# Altium project measure_dev.PrjPcb
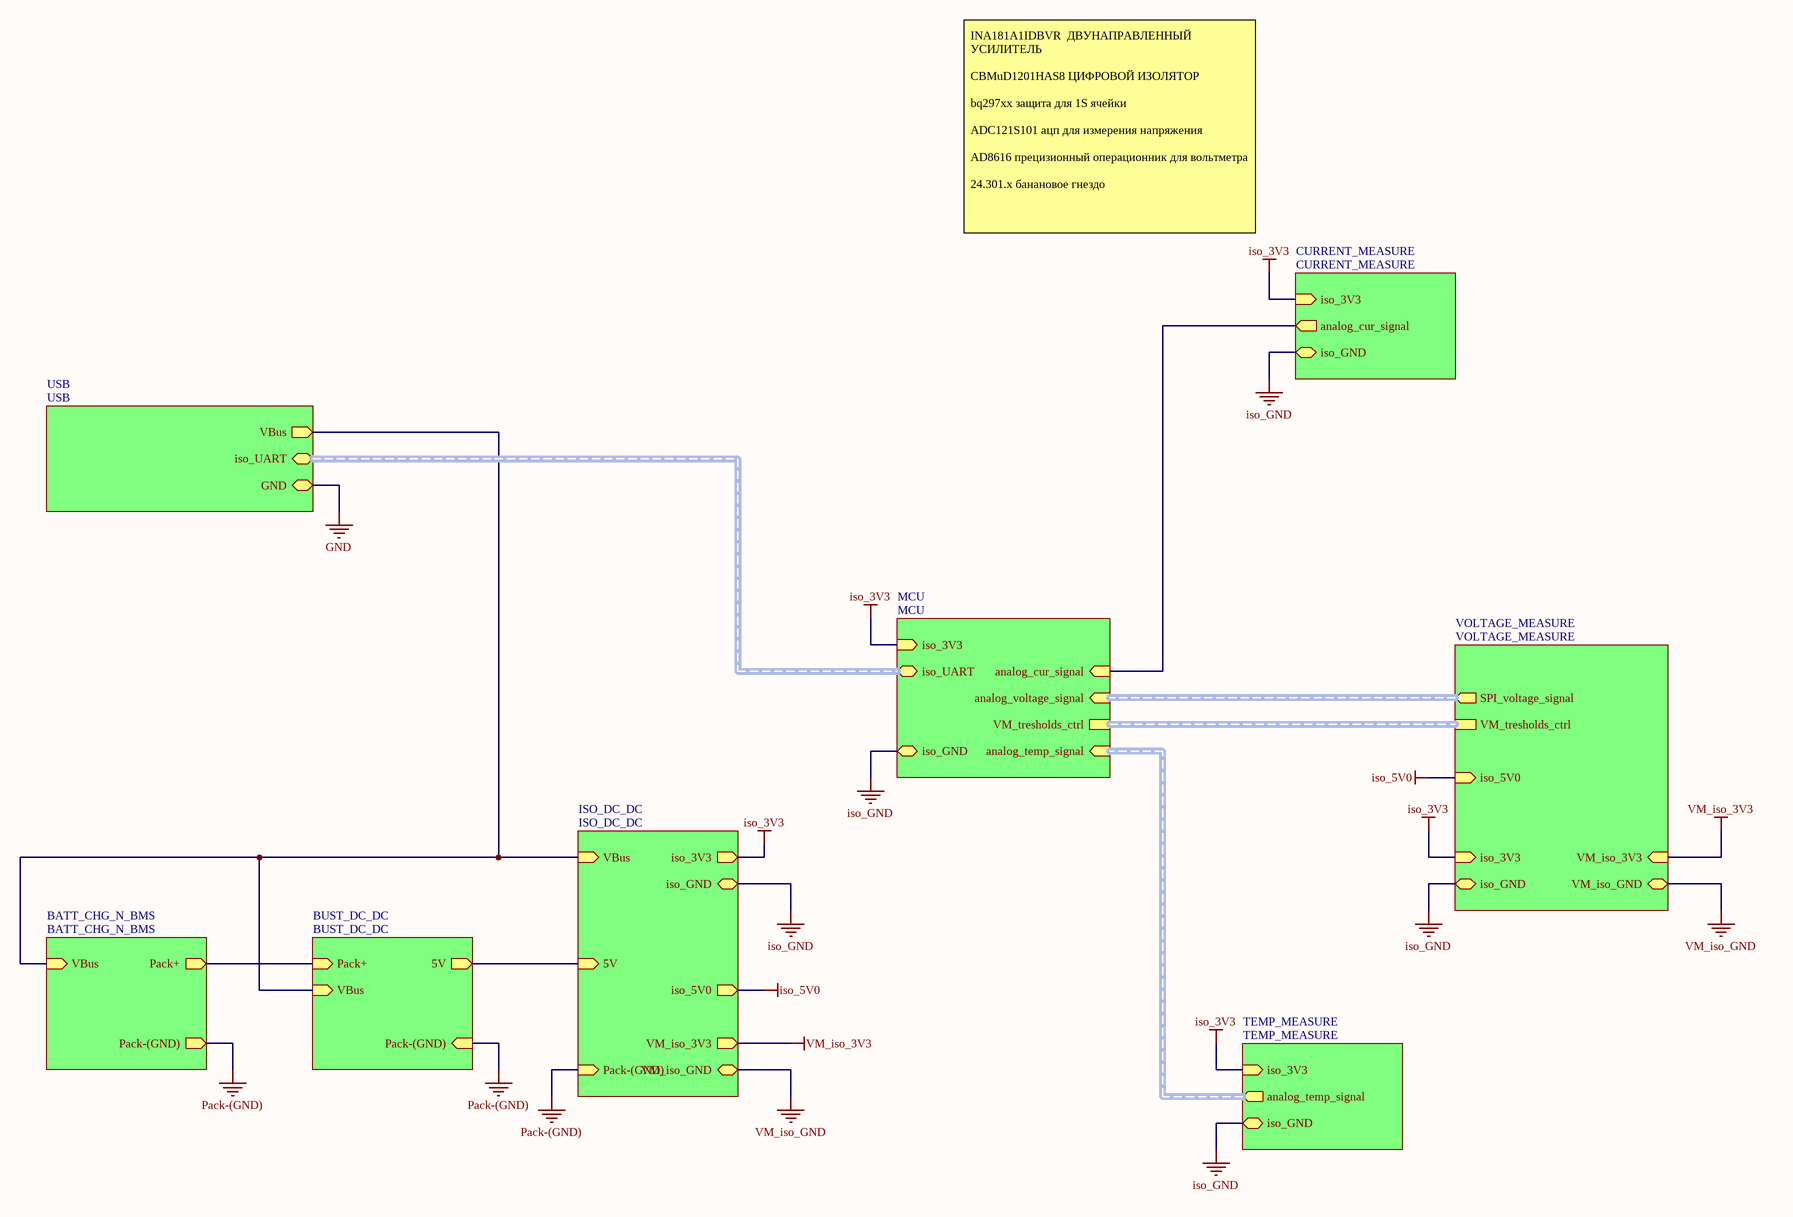
[diagram p0: measure_dev.SchDoc]
9 sheets, 153 parts. Net scope: hierarchical (ports join the sheet entries above them; power ports are global).
Sheets:
  measure_dev.SchDoc
    CURRENT_MEASURE = CURRENT_MEASURE.SchDoc
    MCU = MCU.SchDoc
    USB = USB.SchDoc
    ISO_DC_DC = ISO_DC_DC.SchDoc
    BATT_CHG_N_BMS = BATT_CHG_N_BMS.SchDoc
    BUST_DC_DC = BUST_DC_DC.SchDoc
    VOLTAGE_MEASURE = VOLTAGE_MEASURE.SchDoc
    TEMP_MEASURE = TEMP_MEASURE.SchDoc

## Sheet measure_dev.SchDoc
size A2; SheetNumber: 1; SheetTotal: 9

### Sub-sheets
BATT_CHG_N_BMS = BATT_CHG_N_BMS: VBus (in), Pack+ (out), Pack-(GND) (out)
BUST_DC_DC = BUST_DC_DC: Pack+ (in), 5V (out), Pack-(GND) (in), VBus (in)
CURRENT_MEASURE = CURRENT_MEASURE: iso_3V3 (in), iso_GND (bidir), analog_cur_signal (out)
ISO_DC_DC = ISO_DC_DC: VBus (in), 5V (in), iso_3V3 (out), iso_GND (bidir), VM_iso_3V3 (out), VM_iso_GND (bidir), Pack-(GND) (in), iso_5V0 (out)
MCU = MCU: iso_3V3 (in), iso_GND (bidir), analog_cur_signal (in), iso_UART (bidir), analog_voltage_signal (in), analog_temp_signal (in), VM_tresholds_ctrl
TEMP_MEASURE = TEMP_MEASURE: analog_temp_signal (out), iso_GND (bidir), iso_3V3 (in)
USB = USB: VBus (out), iso_UART (bidir), GND (bidir)
VOLTAGE_MEASURE = VOLTAGE_MEASURE: SPI_voltage_signal (out), iso_GND (bidir), iso_3V3 (in), VM_iso_3V3 (in), VM_iso_GND (bidir), VM_tresholds_ctrl, iso_5V0 (in)

### Nets
5V: sheet ISO_DC_DC/5V, sheet BUST_DC_DC/5V
iso_3V3: sheet CURRENT_MEASURE/iso_3V3, sheet MCU/iso_3V3, sheet ISO_DC_DC/iso_3V3, sheet VOLTAGE_MEASURE/iso_3V3, sheet TEMP_MEASURE/iso_3V3
iso_5V0: sheet ISO_DC_DC/iso_5V0, sheet VOLTAGE_MEASURE/iso_5V0
iso_GND: sheet CURRENT_MEASURE/iso_GND, sheet MCU/iso_GND, sheet ISO_DC_DC/iso_GND, sheet VOLTAGE_MEASURE/iso_GND, sheet TEMP_MEASURE/iso_GND
Pack+: sheet BATT_CHG_N_BMS/Pack+, sheet BUST_DC_DC/Pack+
Pack-(GND): sheet ISO_DC_DC/Pack-(GND), sheet BATT_CHG_N_BMS/Pack-(GND), sheet BUST_DC_DC/Pack-(GND)
VBus: sheet USB/VBus, sheet ISO_DC_DC/VBus, sheet BATT_CHG_N_BMS/VBus, sheet BUST_DC_DC/VBus
VM_iso_3V3: sheet ISO_DC_DC/VM_iso_3V3, sheet VOLTAGE_MEASURE/VM_iso_3V3
VM_iso_GND: sheet ISO_DC_DC/VM_iso_GND, sheet VOLTAGE_MEASURE/VM_iso_GND
NetDD?#1_1: sheet CURRENT_MEASURE/analog_cur_signal, sheet MCU/analog_cur_signal

### Buses and harness runs
harness sheet MCU/analog_temp_signal = sheet TEMP_MEASURE/analog_temp_signal
harness sheet MCU/analog_voltage_signal = sheet VOLTAGE_MEASURE/SPI_voltage_signal
harness sheet MCU/iso_UART = sheet USB/iso_UART
harness sheet MCU/VM_tresholds_ctrl = sheet VOLTAGE_MEASURE/VM_tresholds_ctrl

### Notes on the sheet
- INA181A1IDBVR  ДВУНАПРАВЛЕННЫЙ УСИЛИТЕЛЬ
  CBMuD1201HAS8 ЦИФРОВОЙ ИЗОЛЯТОР
  bq297xx защита для 1S ячейки
  ADC121S101 ацп для измерения напряжения
  AD8616 прецизионный операционник для вольтметра
  24.301.x банановое гнездо

## Sheet CURRENT_MEASURE.SchDoc
size A4; SheetNumber: 4; SheetTotal: 9
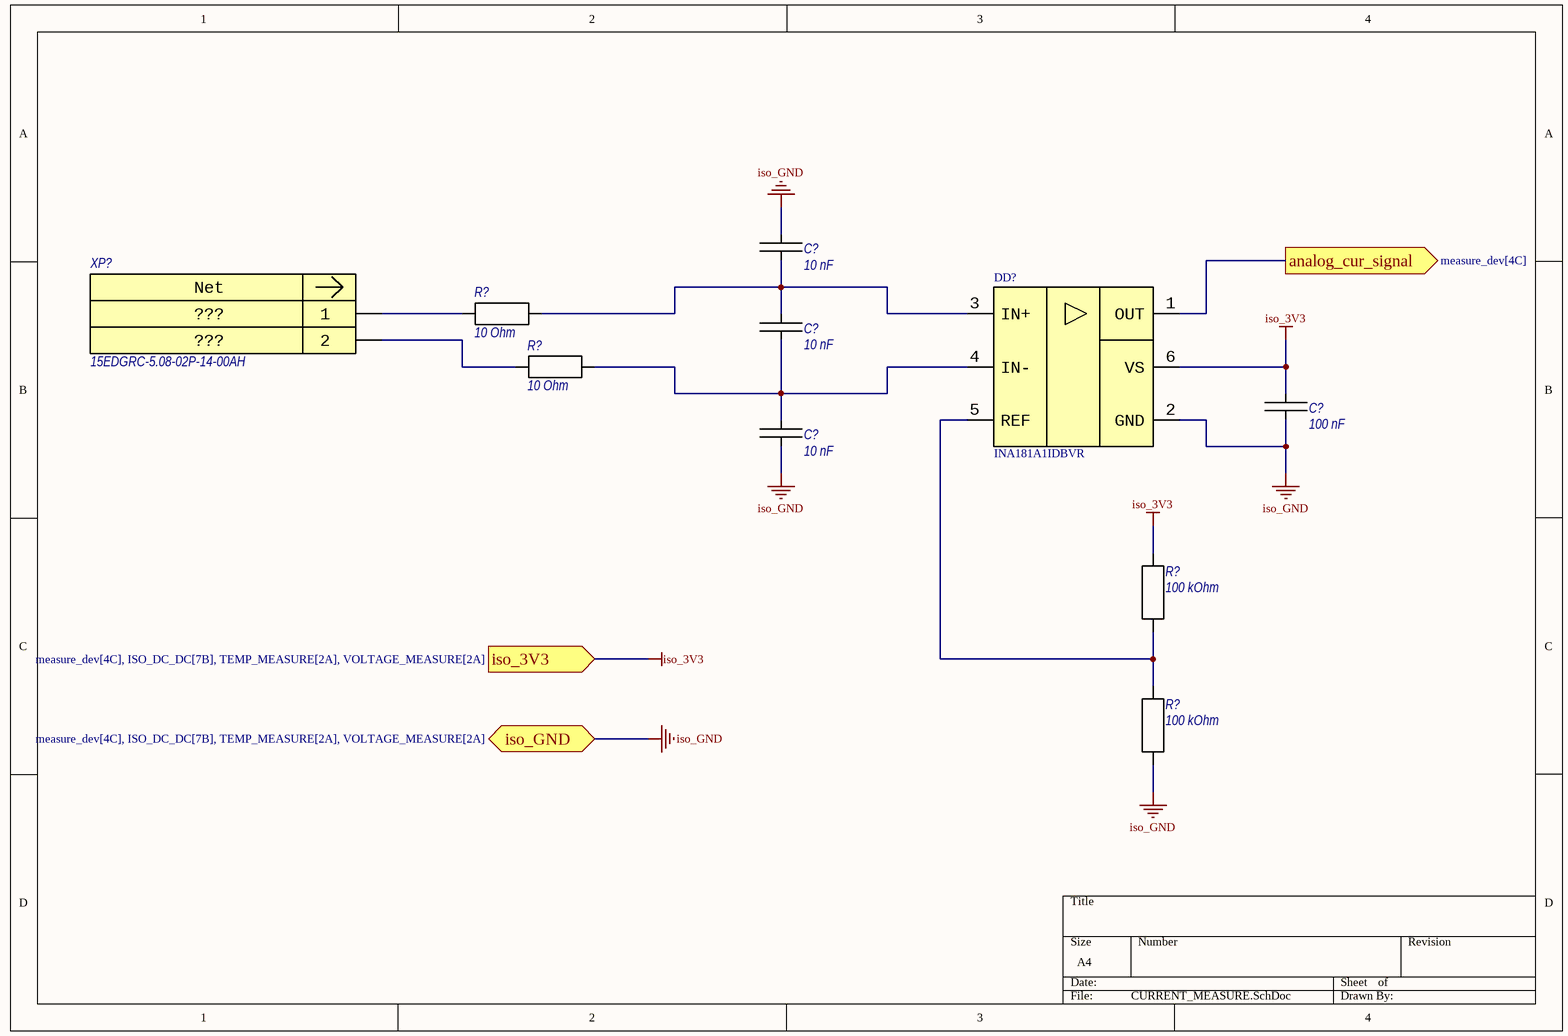
[diagram p1: CURRENT_MEASURE.SchDoc]

### Parts
(Parts that share a designator on the sheet are numbered #1, #2 ... from top to bottom, then left to right.)
C?#1  10 nF  [0603C]
C?#2  10 nF  [0603C]
C?#3  100 nF  [0603C]
C?#4  10 nF  [0603C]
DD?#1  INA181A1IDBVR  [SOT-23-6]
R?#1  10 Ohm  [0603R]
R?#2  10 Ohm  [0603R]
R?#3  100 kOhm  [0603R]
R?#4  100 kOhm  [0603R]
XP?#1  15EDGRC-5.08-02P-14-00AH  [15EDGRC-5.08-02P]

### Ports
analog_cur_signal (out, see measure_dev[4C]), iso_3V3 (in, see measure_dev[4C], ISO_DC_DC[7B], TEMP_MEASURE[2A], VOLTAGE_MEASURE[2A]), iso_GND (bidir, see measure_dev[4C], ISO_DC_DC[7B], TEMP_MEASURE[2A], VOLTAGE_MEASURE[2A])

### Nets
iso_3V3: C?#3.1 DD?#1.6(VS) R?#3.1 ; port iso_3V3
iso_GND: C?#1.1 C?#3.2 C?#4.2 DD?#1.2(GND) R?#4.2 ; port iso_GND
NetC?#1_2: C?#1.2 C?#2.1 DD?#1.3(IN+) R?#1.2
NetC?#2_2: C?#2.2 C?#4.1 DD?#1.4(IN-) R?#2.2
NetDD?#1_1: DD?#1.1(OUT) ; port analog_cur_signal
NetDD?#1_5: DD?#1.5(REF) R?#3.2 R?#4.1
NetR?#1_1: R?#1.1 XP?#1.1
NetR?#2_1: R?#2.1 XP?#1.2

### Notes on the sheet
- (in symbol 15EDGRC-5.08-02P-14-00AH) Net

### Library data of the parts
C?#1 C?#2 C?#4 = CL10B103KB8NNN: Manufacturer: Samsung; Tolerance: 10%; Voltage: 50 V; Dielectric: X7R; Part Number: CL10B103KB8NNN; Package: 0603; Value: 10 nF
C?#3 = CL10B104KB8NNN: Manufacturer: Samsung; Tolerance: 10%; Voltage: 50 V; Dielectric: X7R; Part Number: CL10B104KB8NNN; Package: 0603; Value: 100 nF
DD?#1 = INA181A1IDBVR: -; Manufacturer: TI; Part Number: INA181A1IDBVR; Package: SOT-23-6; Type: Current-Sense bi-directional Amplifier; Datasheet: https://static.chipdip.ru/lib/442/DOC049442855.pdf
R?#1 R?#2 = RC0603FR-0710RL: Manufacturer: Yageo; Tolerance: 1%; Power: 0.100 Watt; Part Number: RC0603FR-0710RL; Package: 0603; Value: 10 Ohm
R?#3 R?#4 = RC0603FR-07100KL: Manufacturer: Yageo; Tolerance: 1%; Power: 0.100 Watt; Part Number: RC0603FR-07100KL; Package: 0603; Value: 100 kOhm
XP?#1 = 15EDGRC-5.08-02P-14-00AH: Manufacturer: DEGSON; Imax: 7 A; Umax: 450 V; Mating Connector: 15EDGK-5.08-02P-14; pin1: ???; Part Number: 15EDGRC-5.08-02P-14-00AH; Datasheet: https://cdn.promelec.ru/upload/items/2020/05/15/15EDGRC-5.08.pdf; pin2: ???; pin3: ???; pin4: ???; pin5: ???; pin6: ???; pin7: ???; pin8: ???; pin9: ???; pin10: ???; pin11: ???; pin12: ???; pin13: ???; pin14: ???; pin15: ???; pin16: ???; pin17: ???; pin18: ???; pin19: ???; pin20: ???; pin21: ???; pin22: ???; pin23: ???; pin24: ???; pin25: ???; pin26: ???; pin27: ???; pin28: ???; pin29: ???; pin30: ???; pin31: ???; pin32: ???; pin33: ???; pin34: ???; pin35: ???; pin36: ???; pin37: ???; pin38: ???; pin39: ???; pin40: ???; pin41: ???; pin42: ???; pin43: ???; pin44: ???; pin45: ???; pin46: ???; pin47: ???; pin48: ???; pin49: ???; pin50: ???

## Sheet MCU.SchDoc
size A2; SheetNumber: 2; SheetTotal: 6
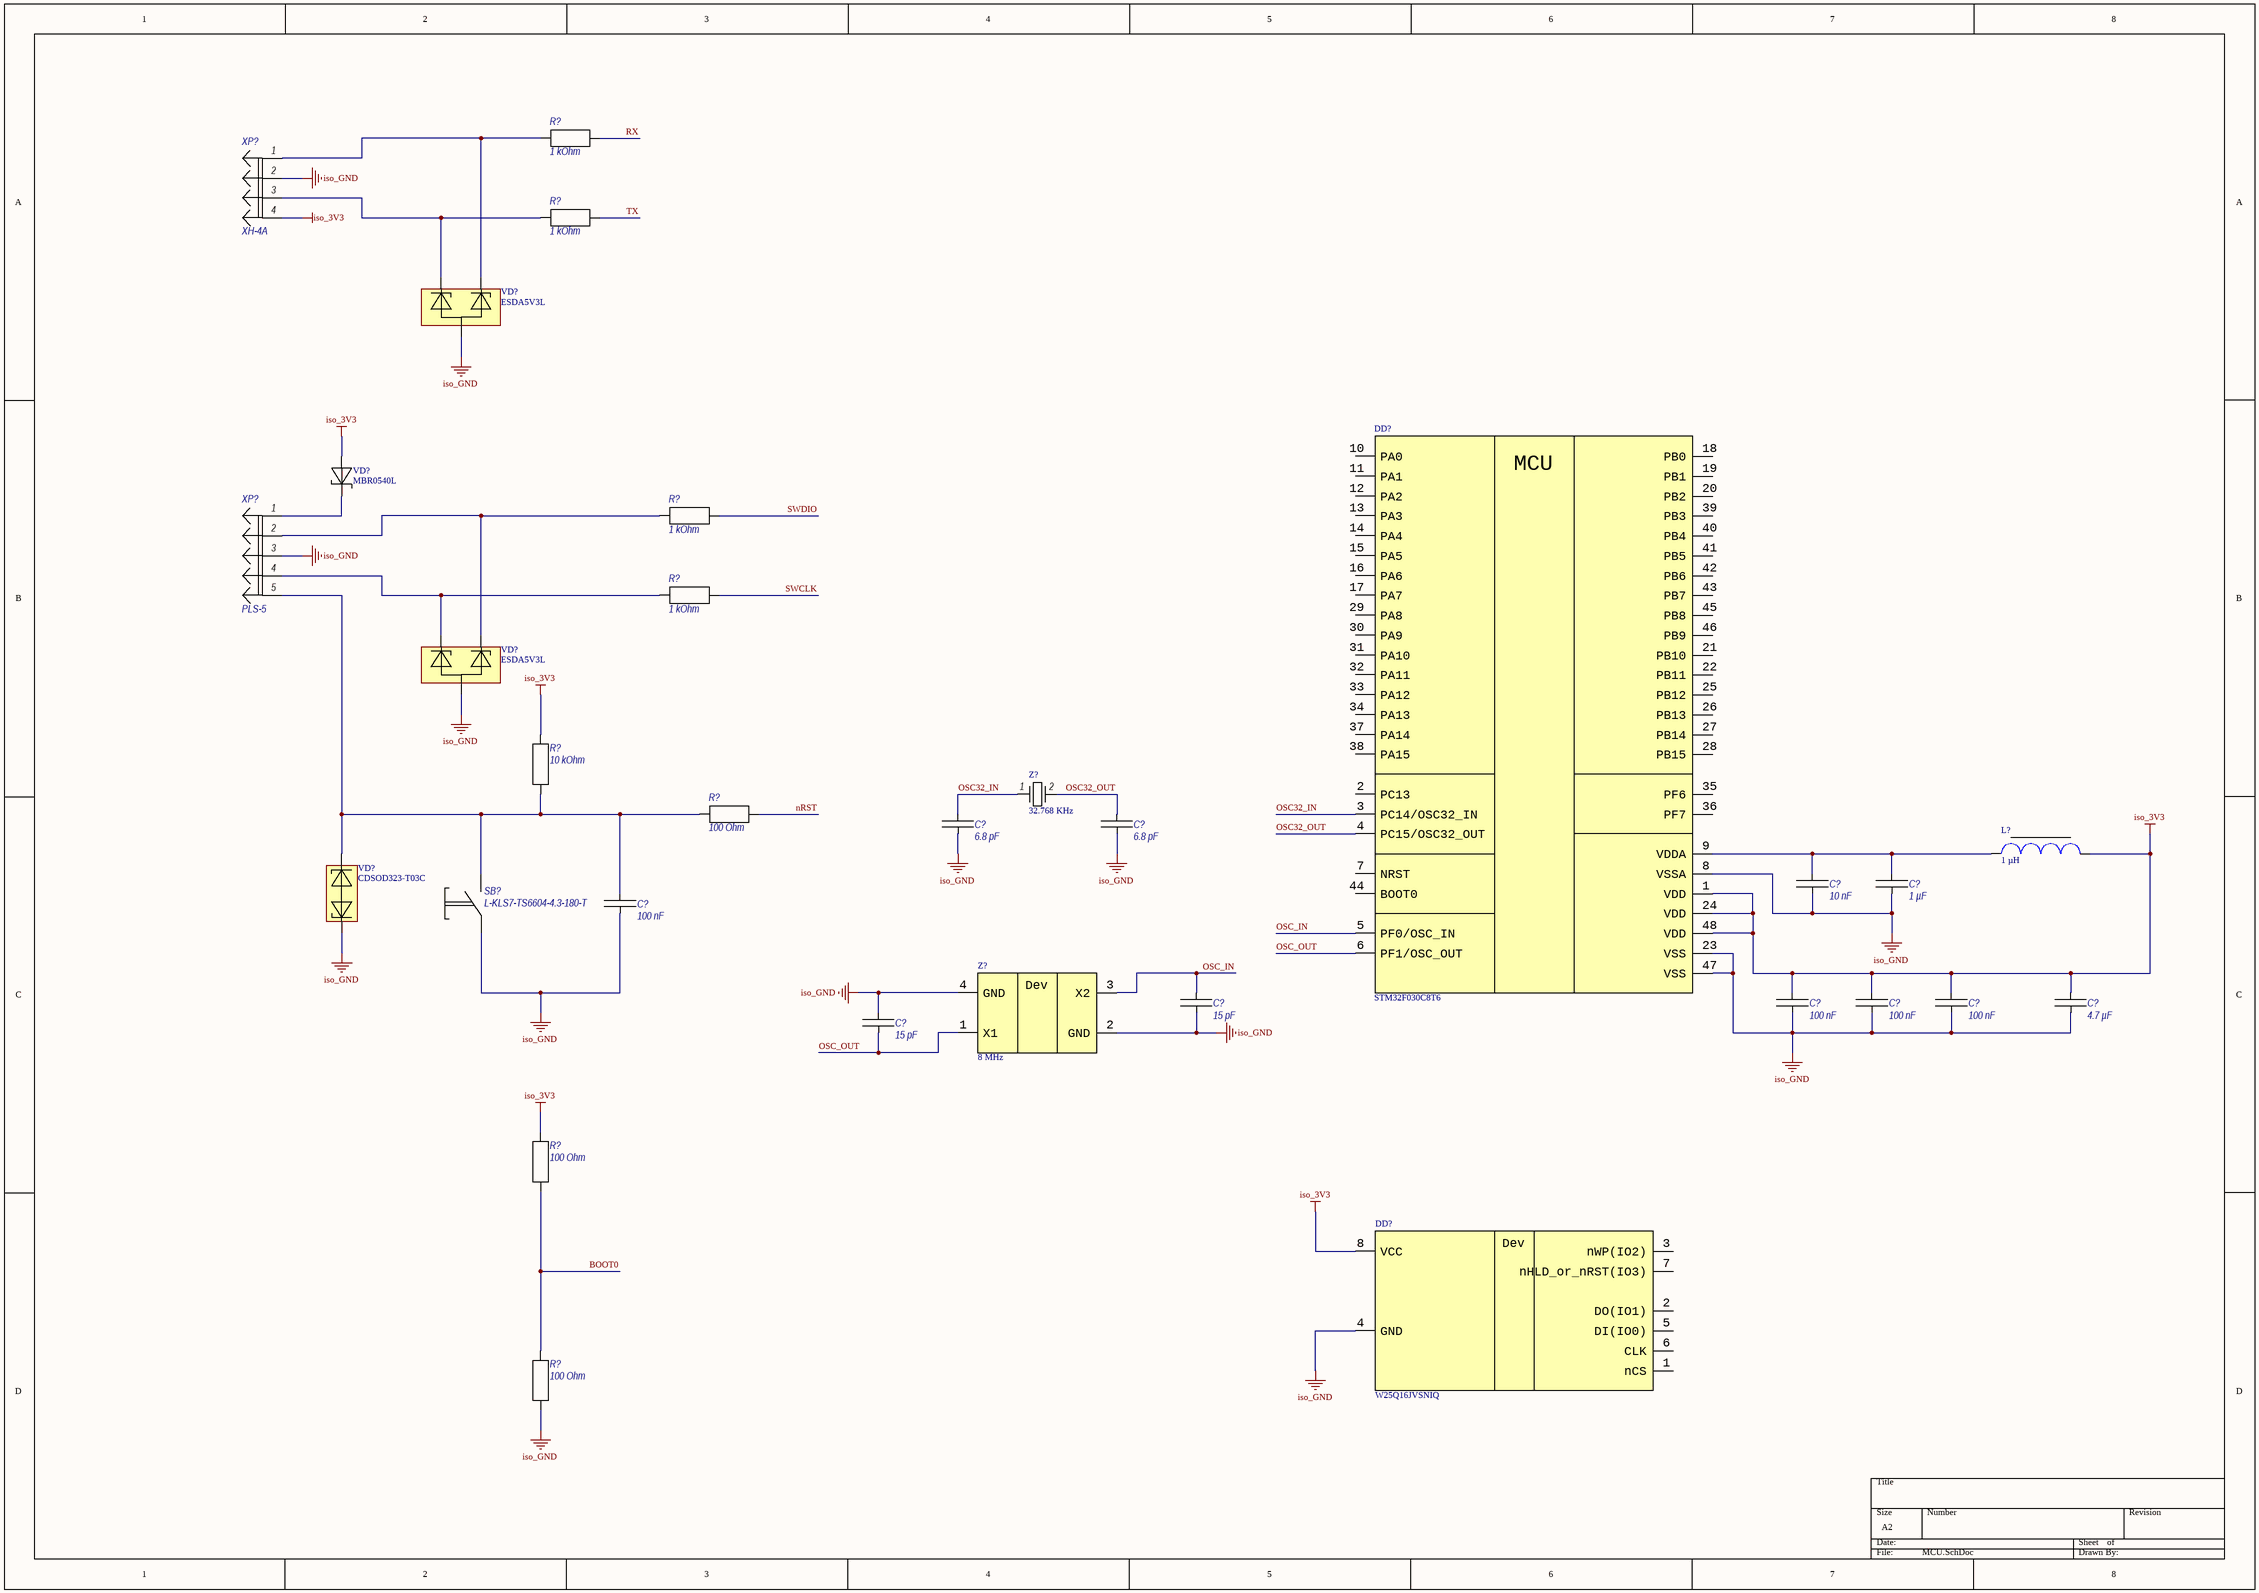
[diagram p2: MCU.SchDoc]

### Parts
(Parts that share a designator on the sheet are numbered #1, #2 ... from top to bottom, then left to right.)
C?#5  6.8 pF  [0603C]
C?#6  6.8 pF  [0603C]
C?#7  10 nF  [0603C]
C?#8  1 µF  [0603C]
C?#9  100 nF  [0603C]
C?#10  15 pF  [0603C]
C?#11  100 nF  [0603C]
C?#12  100 nF  [0603C]
C?#13  100 nF  [0603C]
C?#14  4.7 µF  [0805C]
C?#15  15 pF  [0603C]
DD?#2  STM32F030C8T6  [STM-LQFP48_M]
DD?#3  W25Q16JVSNIQ  [SO-8]
L?#1  1 µH  [0805L]
R?#5  1 kOhm  [0603R]
R?#6  1 kOhm  [0603R]
R?#7  1 kOhm  [0603R]
R?#8  1 kOhm  [0603R]
R?#9  10 kOhm  [0603R]
R?#10  100 Ohm  [0603R]
R?#11  100 Ohm  [0603R]  (no BOM)
R?#12  100 Ohm  [0603R]
SB?  L-KLS7-TS6604-4.3-180-T  [TACT_SWITCH_6X6]
VD?#1  ESDA5V3L  [SOT-23-3]
VD?#2  MBR0540L  [SOD-123]
VD?#3  ESDA5V3L  [SOT-23-3]
VD?#4  CDSOD323-T03C  [SOD-323]
XP?#2  XH-4A  [XH-2.54-4]
XP?#3  PLS-5  [PLS-5]
Z?#1  32.768 KHz  [CRYSTAL_32X15]
Z?#2  8 MHz  [CRYSTAL_32X25]

### Nets
iso_3V3: C?#11.1 C?#12.1 C?#13.1 C?#14.1 DD?#2.1(VDD) DD?#2.24(VDD) DD?#2.48(VDD) DD?#3.8(VCC) L?#1.2 R?#9.1 R?#11.1 VD?#2.A XP?#2.4
iso_GND: C?#5.2 C?#6.2 C?#7.2 C?#8.2 C?#9.2 C?#10.2 C?#11.2 C?#12.2 C?#13.2 C?#14.2 C?#15.1 DD?#2.8(VSSA) DD?#2.23(VSS) DD?#2.47(VSS) DD?#3.4(GND) R?#12.2 SB?.1 VD?#1.3 VD?#3.3 VD?#4.A XP?#2.2 XP?#3.3 Z?#2.2(GND) Z?#2.4(GND)
BOOT0: R?#11.2 R?#12.1
nRST: R?#10.1
OSC32_IN: C?#5.1 DD?#2.3(PC14/OSC32_IN) Z?#1.1(OSC1)
OSC32_OUT: C?#6.1 DD?#2.4(PC15/OSC32_OUT) Z?#1.2(OSC2)
OSC_IN: C?#10.1 DD?#2.5(PF0/OSC_IN) Z?#2.3(X2)
OSC_OUT: C?#15.2 DD?#2.6(PF1/OSC_OUT) Z?#2.1(X1)
RX: R?#5.1
SWCLK: R?#8.1
SWDIO: R?#7.1
TX: R?#6.1
NetC?#7_1: C?#7.1 C?#8.1 DD?#2.9(VDDA) L?#1.1
NetC?#9_1: C?#9.1 R?#9.2 R?#10.2 SB?.2 VD?#4.C XP?#3.5
NetR?#5_2: R?#5.2 VD?#1.1 XP?#2.1
NetR?#6_2: R?#6.2 VD?#1.2 XP?#2.3
NetR?#7_2: R?#7.2 VD?#3.1 XP?#3.2
NetR?#8_2: R?#8.2 VD?#3.2 XP?#3.4
NetVD?#2_C: VD?#2.C XP?#3.1

Not connected (* = marked no-connect by the designer): DD?#2 2(PC13) 7(NRST) 10(PA0) 11(PA1) 12(PA2) 13(PA3) 14(PA4) 15(PA5) 16(PA6) 17(PA7) 18(PB0) 19(PB1) 20(PB2) 21(PB10) 22(PB11) 25(PB12) 26(PB13) 27(PB14) 28(PB15) 29(PA8) 30(PA9) 31(PA10) 32(PA11) 33(PA12) 34(PA13) 35(PF6) 36(PF7) 37(PA14) 38(PA15) 39(PB3) 40(PB4) 41(PB5) 42(PB6) 43(PB7) 44(BOOT0) 45(PB8) 46(PB9); DD?#3 1(nCS) 2(DO(IO1)) 3(nWP(IO2)) 5(DI(IO0)) 6(CLK) 7(nHLD_or_nRST(IO3))

### Notes on the sheet
- (in symbol KSE-7U08000MAB143ZA3) Dev
- (in symbol STM32F030C8T6) MCU
- (in symbol W25Q16JVSNIQ) Dev

### Library data of the parts
C?#5 C?#6 = CL10C6R8CB8NNN: Manufacturer: Samsung; Tolerance: 0.25 pF; Voltage: 50 V; Dielectric: NP0; Part Number: CL10C6R8CB8NNN; Package: 0603; Value: 6.8 pF
C?#7 = CL10B103KB8NNN: as C?#1 on sheet CURRENT_MEASURE; Part Number: CL10B103KB8NNN; Package: 0603; Value: 10 nF
C?#8 = CL10B105KB8NNN: Manufacturer: Samsung; Tolerance: 10%; Voltage: 50 V; Dielectric: X7R; Part Number: CL10B105KB8NNN; Package: 0603; Value: 1 µF
C?#9 C?#11-C?#13 = CL10B104KB8NNN: as C?#3 on sheet CURRENT_MEASURE; Part Number: CL10B104KB8NNN; Package: 0603; Value: 100 nF
C?#10 C?#15 = CL10C150JB8NNN: Manufacturer: Samsung; Tolerance: 5%; Voltage: 50 V; Dielectric: NP0; Part Number: CL10C150JB8NNN; Package: 0603; Value: 15 pF
C?#14 = CL21B475KPFNNN: Manufacturer: Samsung; Tolerance: 10%; Voltage: 10 V; Dielectric: X7R; Part Number: CL21B475KPFNNN; Package: 0805; Value: 4.7 µF
DD?#2 = STM32F030C8T6: Manufacturer: STMicroelectronics; Part Number: STM32F030C8T6; Package: LQFP48; Datasheet: https://www.alldatasheet.com/datasheet-pdf/view/1132289/STMICROELECTRONICS/STM32F030C8.html
DD?#3 = W25Q16JVSNIQ: SPI flash; Manufacturer: WINBOND; Part Number: W25Q16JVSNIQ; Package: SO-8; Size: 16M-bit; Type: flash; Datasheet: https://static.chipdip.ru/lib/137/DOC012137593.pdf
L?#1 = LQM21FN1R0N00: Manufacturer: MURATA; max Current: 220 mA; Part Number: LQM21FN1R0N00; Package: 0805; Inductance: 1 µH; Datasheet: https://doc.platan.ru/pdf/datasheets/murata/LQM21FN_00.pdf
R?#5-R?#8 = RC0603FR-071KL: Manufacturer: Yageo; Tolerance: 1%; Power: 0.100 Watt; Part Number: RC0603FR-071KL; Package: 0603; Value: 1 kOhm
R?#9 = RC0603FR-0710KL: Manufacturer: Yageo; Tolerance: 1%; Power: 0.100 Watt; Part Number: RC0603FR-0710KL; Package: 0603; Value: 10 kOhm
R?#10-R?#12 = RC0603FR-07100RL: Manufacturer: Yageo; Tolerance: 1%; Power: 0.100 Watt; Part Number: RC0603FR-07100RL; Package: 0603; Value: 100 Ohm
SB? = L-KLS7-TS6604-4.3-180-T: -; Manufacturer: KLS; Current: 50 mA; Voltage: 12 VDC; Resistance: 50 mOhm; Part Number: L-KLS7-TS6604-4.3-180-T; Package: TACT_SWITCH_6X6; Type: Tact switch; Datasheet: https://doc.platan.ru/pdf/datasheets/kls/KLS7-TS6604.pdf
VD?#1 VD?#3 = ESDA5V3L: Manufacturer: UMW; Reverse Voltage: 3.3 V; Part Number: ESDA5V3L; Package: SOT-23-3; max Current: -; Pppm: -; Datasheet: https://static.chipdip.ru/lib/681/DOC059681356.pdf
VD?#2 = MBR0540L: Manufacturer: HOTTECH; max Current: 500 mA; Reverse Voltage: 40 V; Part Number: MBR0540L; Package: SOD-123; Datasheet: https://doc.platan.ru/pdf/datasheets/hottech/MBR0520L-0540L.pdf
VD?#4 = CDSOD323-T03C: Manufacturer: UMW; Reverse Voltage: 3.3 V; Part Number: CDSOD323-T03C; Package: SOD-323; max Current: -; Pppm: -; Datasheet: https://static.chipdip.ru/lib/635/DOC059635678.pdf
XP?#2 = XH-4A: Manufacturer: JST; Imax: 3 A; Umax: 250 V; Mating Connector: XH-4Y; Part Number: XH-4A; Datasheet: www.digikey.es/en/resources/datasheets/jst/xh-connector?srsltid=AfmBOoo9sSFbM4Eu62APurDC7SwqQmd8KbPfwRIn_mEfewP-rqs9ANFl
XP?#3 = PLS-5: Manufacturer: NXU/CONNFLY; Imax: 1 A; Umax: 500 V; Part Number: PLS-5; Mating Connector: -; Datasheet: https://doc.platan.ru/pdf/datasheets/xn/112A.pdf
Z?#1 = KSE-7L32768K7Z2400A3: Manufacturer: Keen Side Electronics; Tolerance: 20 ppm; Load Cap: 7 pF; Part Number: KSE-7L32768K7Z2400A3; Package: 3215; Frequency: 32.768 KHz; Datasheet: https://static.chipdip.ru/lib/163/DOC045163694.pdf
Z?#2 = KSE-7U08000MAB143ZA3: Manufacturer: Keen Side Electronics; Tolerance: 10 ppm; Load Cap: 12 pF; Part Number: KSE-7U08000MAB143ZA3; Package: 3225; Frequency: 8 MHz; Datasheet: https://static.chipdip.ru/lib/163/DOC045163688.pdf

## Sheet USB.SchDoc
size A4; SheetNumber: 3; SheetTotal: 9
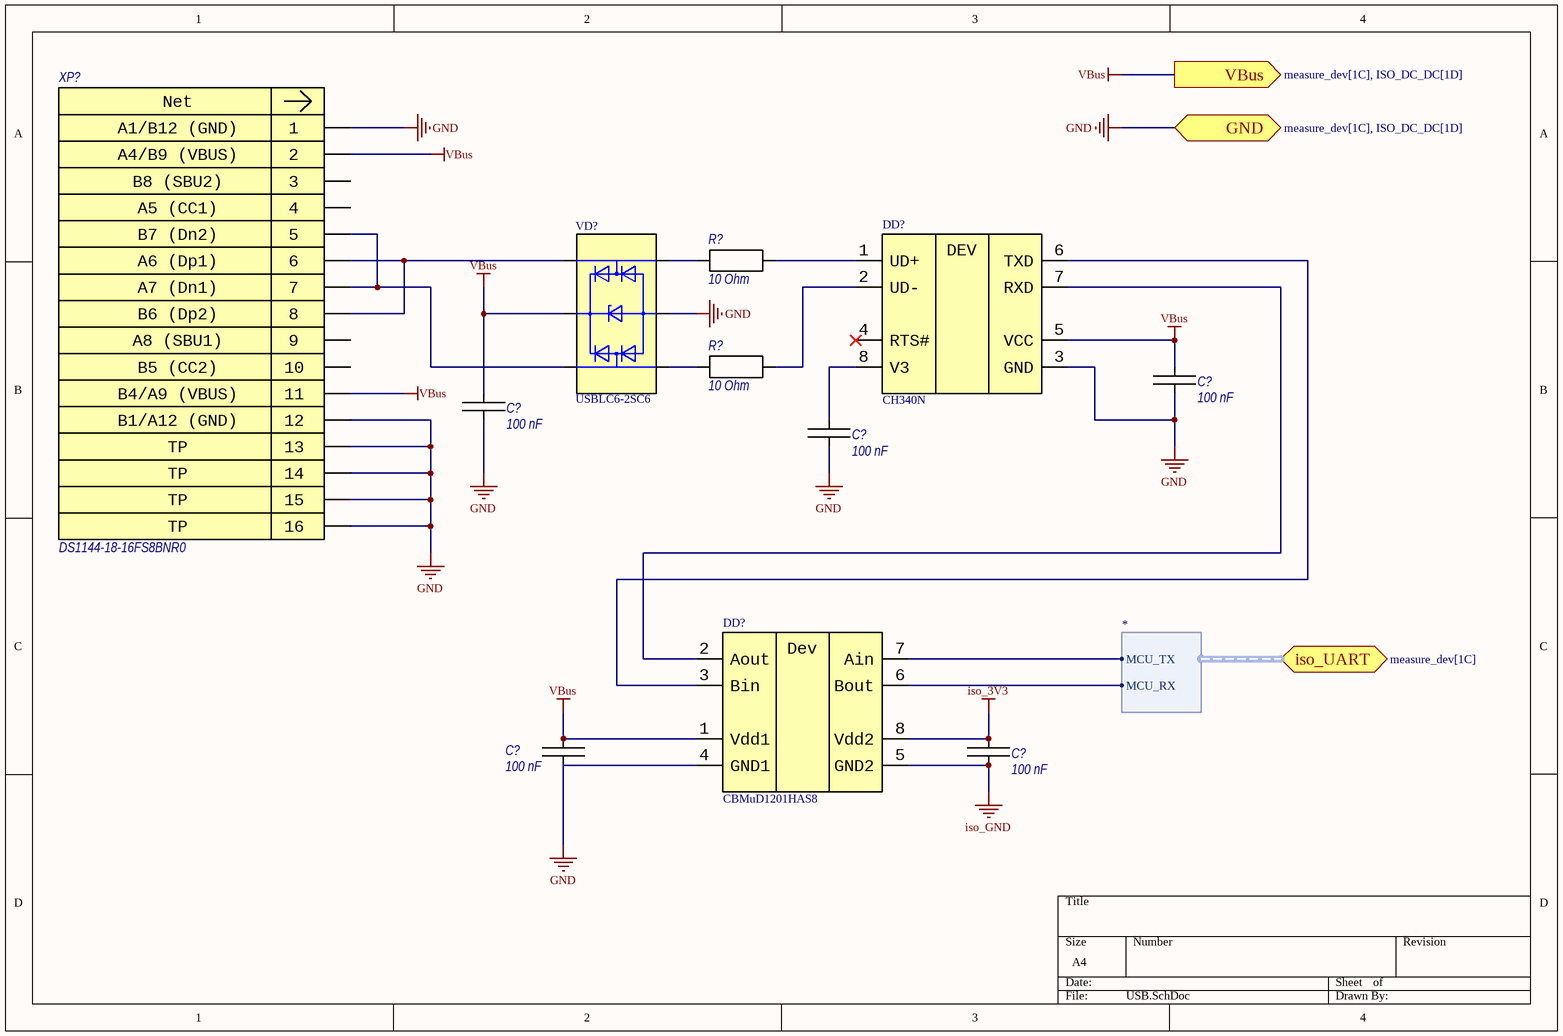
[diagram p3: USB.SchDoc]

### Parts
(Parts that share a designator on the sheet are numbered #1, #2 ... from top to bottom, then left to right.)
C?#16  100 nF  [0603C]
C?#17  100 nF  [0603C]
C?#18  100 nF  [0603C]
C?#19  100 nF  [0603C]
C?#20  100 nF  [0603C]
DD?#4  CH340N  [SO-8]
DD?#5  CBMuD1201HAS8  [SO-8]
R?#13  10 Ohm  [0603R]
R?#14  10 Ohm  [0603R]
VD?#5  USBLC6-2SC6  [SOT-23-6]
XP?#4  DS1144-18-16FS8BNR0  [USB-C_16P]

### Ports
GND (bidir, see measure_dev[1C], ISO_DC_DC[1D]), iso_UART (bidir, harness *, see measure_dev[1C]), VBus (out, see measure_dev[1C], ISO_DC_DC[1D])

### Harnesses
*: MCU_TX, MCU_RX

### Nets
GND: C?#16.2 C?#17.2 C?#18.2 C?#19.2 DD?#4.3(GND) DD?#5.4(GND1) VD?#5.2 XP?#4.1 XP?#4.12 XP?#4.13 XP?#4.14 XP?#4.15 XP?#4.16 ; port GND
iso_3V3: C?#20.1 DD?#5.8(Vdd2)
iso_GND: C?#20.2 DD?#5.5(GND2)
VBus: C?#16.1 C?#17.1 C?#19.1 DD?#4.5(VCC) DD?#5.1(Vdd1) VD?#5.5 XP?#4.2 XP?#4.11 ; port VBus
NetC?#18_1: C?#18.1 DD?#4.8(V3)
NetDD?#4_1: DD?#4.1(UD+) R?#13.1
NetDD?#4_2: DD?#4.2(UD-) R?#14.1
NetDD?#4_6: DD?#4.6(TXD) DD?#5.3(Bin)
NetDD?#4_7: DD?#4.7(RXD) DD?#5.2(Aout)
NetDD?#5_6: DD?#5.6(Bout) ; port iso_UART.MCU_RX
NetDD?#5_7: DD?#5.7(Ain) ; port iso_UART.MCU_TX
NetR?#13_2: R?#13.2 VD?#5.3
NetR?#14_2: R?#14.2 VD?#5.1
NetVD?#5_4: VD?#5.4 XP?#4.6 XP?#4.8
NetVD?#5_6: VD?#5.6 XP?#4.5 XP?#4.7

Not connected (* = marked no-connect by the designer): DD?#4 4(RTS#)*; XP?#4 3 4 9 10

### Notes on the sheet
- (in symbol CBMuD1201HAS8) Dev
- (in symbol CH340N) DEV
- (in symbol DS1144-18-16FS8BNR0) Net; A1/B12 (GND); A4/B9 (VBUS); B8 (SBU2); A5 (CC1); B7 (Dn2); A6 (Dp1); A7 (Dn1); B6 (Dp2); A8 (SBU1); B5 (CC2); B4/A9 (VBUS); B1/A12 (GND); TP

### Library data of the parts
C?#16-C?#20 = CL10B104KB8NNN: as C?#3 on sheet CURRENT_MEASURE; Part Number: CL10B104KB8NNN; Package: 0603; Value: 100 nF
DD?#4 = CH340N: USB to serial port converter; Manufacturer: WCH; Part Number: CH340N; Package: SO-8; Datasheet: https://static.chipdip.ru/lib/375/DOC030375417.pdf
DD?#5 = CBMuD1201HAS8: Manufacturer: COREBAI; Number of Channels: 2; Part Number: CBMuD1201HAS8; Package: SO-8; Input Current: -; Input Reverse Voltage: -; Output Current: -; Output Power: -; Type: digital isolator 2 directions 2 ways; Datasheet: https://static.chipdip.ru/lib/815/DOC059815915.pdf
R?#13 R?#14 = RC0603FR-0710RL: as R?#1 on sheet CURRENT_MEASURE; Part Number: RC0603FR-0710RL; Package: 0603; Value: 10 Ohm
VD?#5 = USBLC6-2SC6: Manufacturer: STMicroelectronics; Part Number: USBLC6-2SC6; Package: SOT-23-6; Datasheet: file:///D:/downloads/usblc6-2.pdf
XP?#4 = DS1144-18-16FS8BNR0: Manufacturer: CONNFLY; Part Number: DS1144-18-16FS8BNR0; Imax: -; Umax: -; Mating Connector: -; Datasheet: https://doc.platan.ru/pdf/datasheets/connfly/DS1144-18.pdf

## Sheet ISO_DC_DC.SchDoc
size A2; SheetNumber: 9; SheetTotal: 9
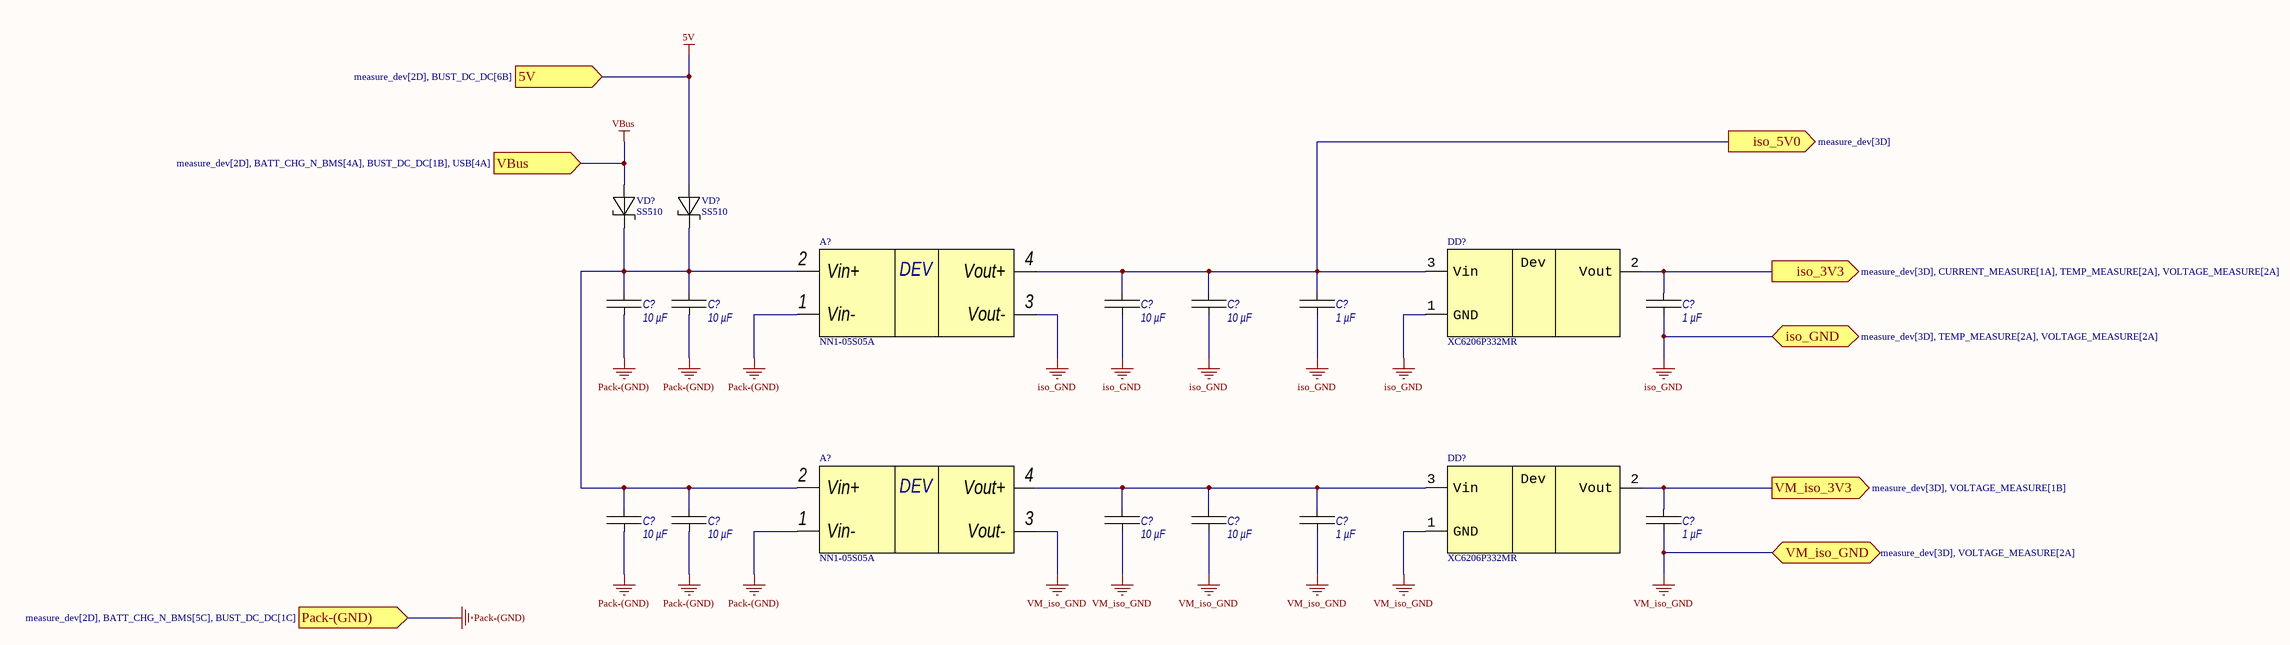
[diagram p4: ISO_DC_DC.SchDoc]

### Parts
(Parts that share a designator on the sheet are numbered #1, #2 ... from top to bottom, then left to right.)
A?#1  NN1-05S05A  [NN1-XXSXXA]
A?#2  NN1-05S05A  [NN1-XXSXXA]
C?#21  10 µF  [1206C]
C?#22  10 µF  [1206C]
C?#23  10 µF  [1206C]
C?#24  10 µF  [1206C]
C?#25  1 µF  [0603C]
C?#26  1 µF  [0603C]
C?#27  10 µF  [1206C]
C?#28  10 µF  [1206C]
C?#29  10 µF  [1206C]
C?#30  10 µF  [1206C]
C?#31  1 µF  [0603C]
C?#32  1 µF  [0603C]
DD?#6  XC6206P332MR  [SOT-23-3]
DD?#7  XC6206P332MR  [SOT-23-3]
VD?#6  SS510  [DO-214AC]
VD?#7  SS510  [DO-214AC]

### Ports
5V (in, see measure_dev[2D], BUST_DC_DC[6B]), iso_3V3 (out, see measure_dev[3D], CURRENT_MEASURE[1A], TEMP_MEASURE[2A], VOLTAGE_MEASURE[2A]), iso_5V0 (out, see measure_dev[3D]), iso_GND (bidir, see measure_dev[3D], TEMP_MEASURE[2A], VOLTAGE_MEASURE[2A]), Pack-(GND) (in, see measure_dev[2D], BATT_CHG_N_BMS[5C], BUST_DC_DC[1C]), VBus (in, see measure_dev[2D], BATT_CHG_N_BMS[4A], BUST_DC_DC[1B], USB[4A]), VM_iso_3V3 (out, see measure_dev[3D], VOLTAGE_MEASURE[1B]), VM_iso_GND (bidir, see measure_dev[3D], VOLTAGE_MEASURE[2A])

### Nets
5V: VD?#7.A ; port 5V
iso_3V3: C?#26.1 DD?#6.2(Vout) ; port iso_3V3
iso_5V0: A?#1.4(Vout+) C?#23.1 C?#24.1 C?#25.1 DD?#6.3(Vin) ; port iso_5V0
iso_GND: A?#1.3(Vout-) C?#23.2 C?#24.2 C?#25.2 C?#26.2 DD?#6.1(GND) ; port iso_GND
Pack-(GND): A?#1.1(Vin-) A?#2.1(Vin-) C?#21.2 C?#22.2 C?#27.2 C?#28.2 ; port Pack-(GND)
VBus: VD?#6.A ; port VBus
VM_iso_3V3: C?#32.1 DD?#7.2(Vout) ; port VM_iso_3V3
VM_iso_GND: A?#2.3(Vout-) C?#29.2 C?#30.2 C?#31.2 C?#32.2 DD?#7.1(GND) ; port VM_iso_GND
NetA?#1_2: A?#1.2(Vin+) A?#2.2(Vin+) C?#21.1 C?#22.1 C?#27.1 C?#28.1 VD?#6.C VD?#7.C
NetA?#2_4: A?#2.4(Vout+) C?#29.1 C?#30.1 C?#31.1 DD?#7.3(Vin)

### Notes on the sheet
- (in symbol NN1-05S05A) DEV
- (in symbol XC6206P332MR) Dev

### Library data of the parts
A?#1 A?#2 = NN1-05S05A: Manufacturer: DEXU Electronics; max Current: 200 mA; Vin min: 4.5 V; Vin max: 5.5 V; Vout min: 5 V; Part Number: NN1-05S05A; Package: NN1-XXSXXA; Vout max: 5 V; Vref: -; Type: isol DC/DC; Datasheet: https://static.chipdip.ru/lib/422/DOC033422675.pdf
C?#21-C?#24 C?#27-C?#30 = CL31B106KBHNNN: Manufacturer: Samsung; Tolerance: 10%; Voltage: 50 V; Dielectric: X7R; Part Number: CL31B106KBHNNN; Package: 1206; Value: 10 µF
C?#25 C?#26 C?#31 C?#32 = CL10B105KB8NNN: as C?#8 on sheet MCU; Part Number: CL10B105KB8NNN; Package: 0603; Value: 1 µF
DD?#6 DD?#7 = XC6206P332MR: Manufacturer: YOUTAI; max Current: 500 mA (300 mW); Vin max: 9 V; Vout min: 3.3 V; Part Number: XC6206P332MR; Package: SOT-23-3; Vin min: -; Vout max: 3.3 V; Vref: -; Type: LDO; Datasheet: https://static.chipdip.ru/lib/848/DOC018848972.pdf
VD?#6 VD?#7 = SS510: Manufacturer: UMW; max Current: 5 A; Reverse Voltage: 100 V; Part Number: SS510; Package: DO-214AC; Pppm: -; Datasheet: https://static.chipdip.ru/lib/293/DOC021293920.pdf

## Sheet BATT_CHG_N_BMS.SchDoc
size A2; SheetNumber: 5; SheetTotal: 9
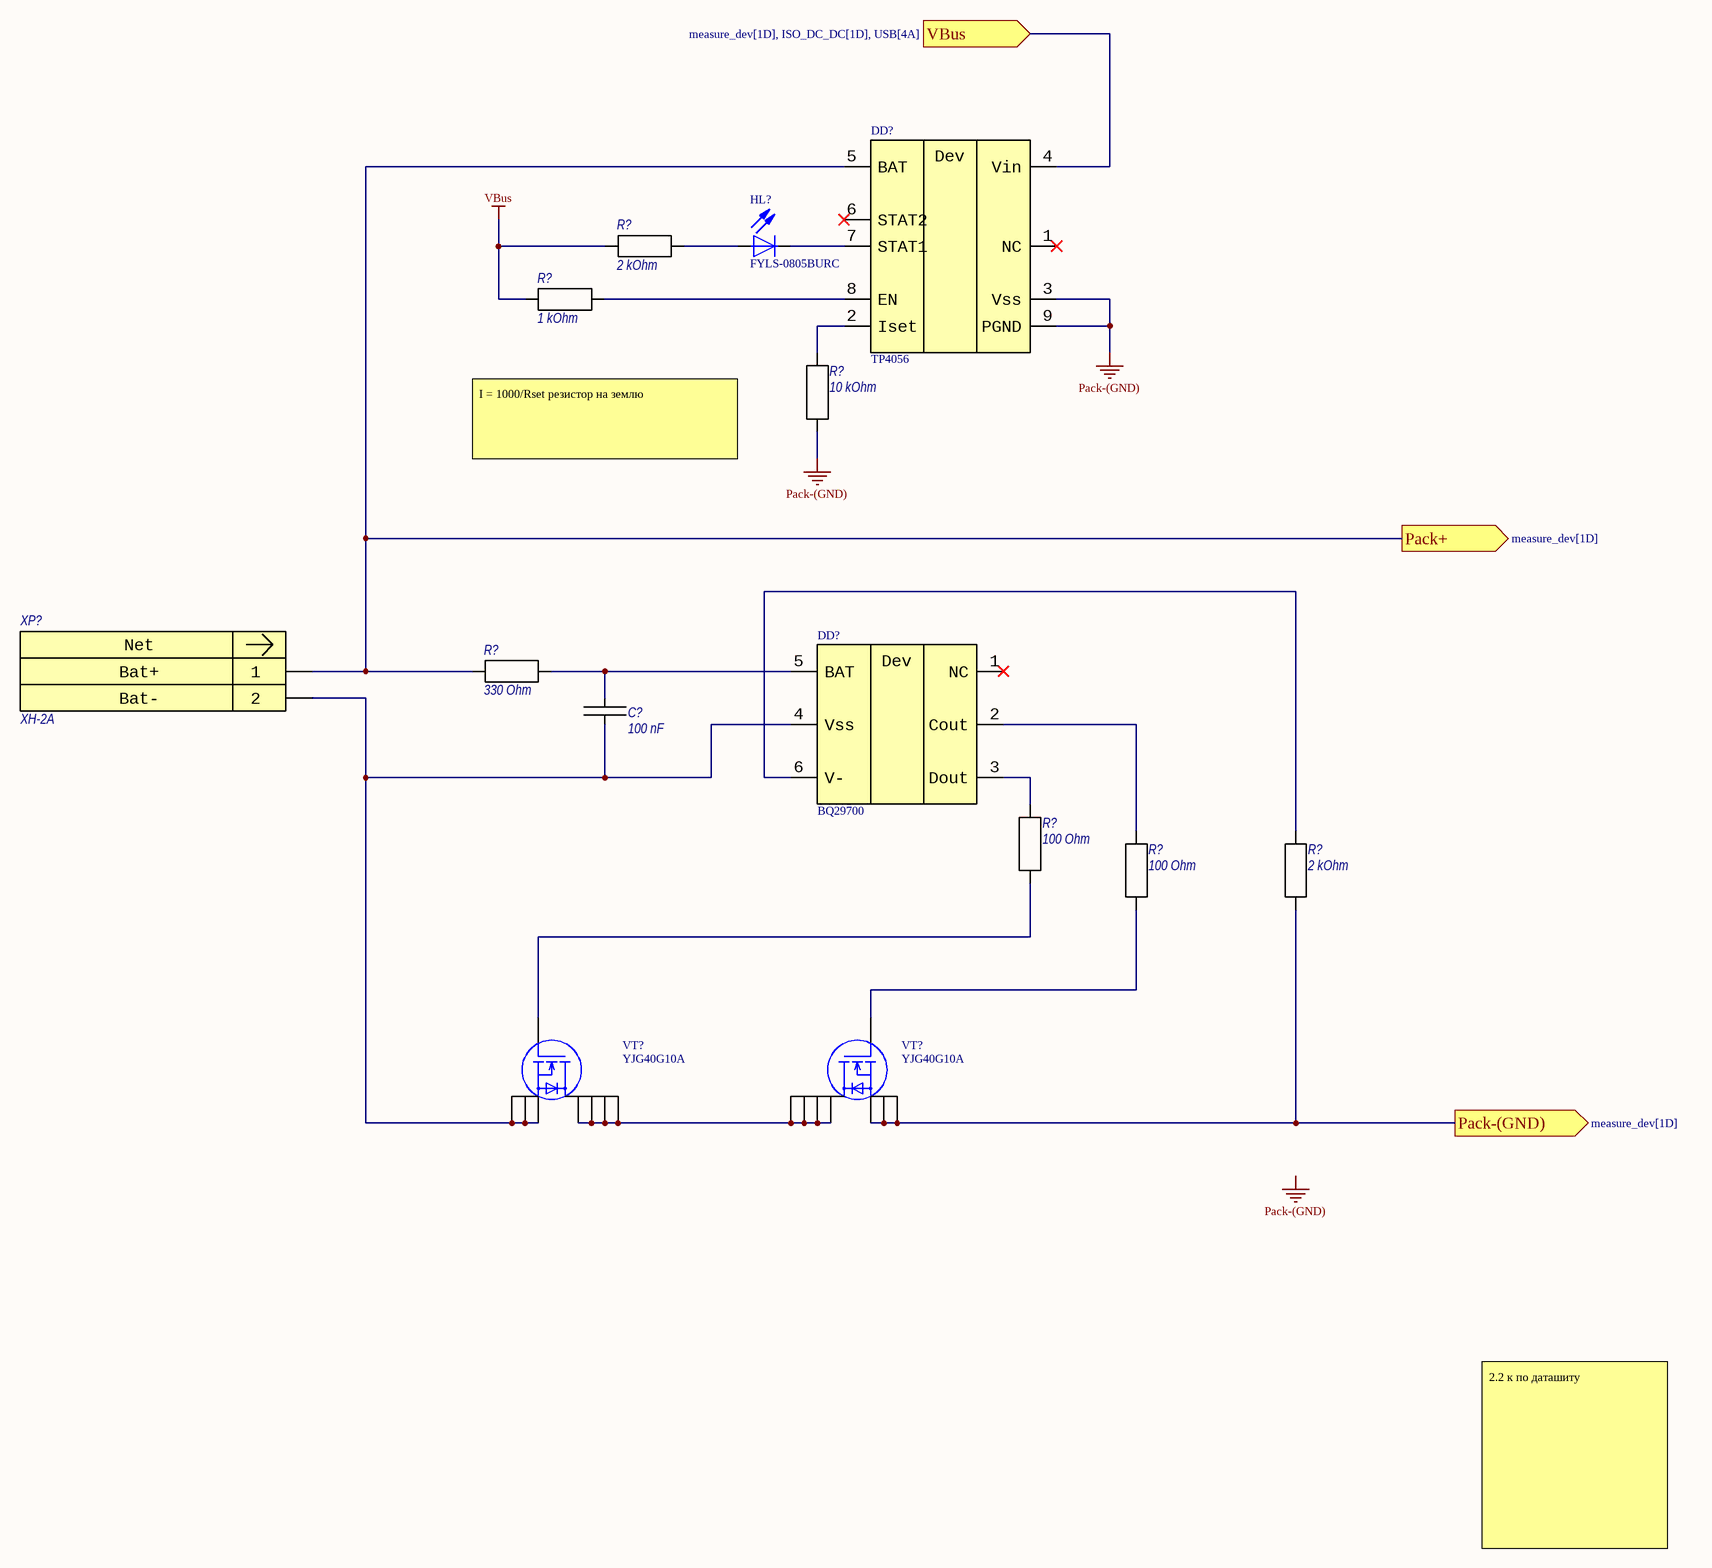
[diagram p5: BATT_CHG_N_BMS.SchDoc]

### Parts
(Parts that share a designator on the sheet are numbered #1, #2 ... from top to bottom, then left to right.)
C?#33  100 nF  [0603C]
DD?#8  TP4056  [SO-8_PowerPAD]
DD?#9  BQ29700  [WSON-6P-1.5X1.5]
HL?  FYLS-0805BURC  [0805LED]
R?#15  2 kOhm  [0603R]
R?#16  1 kOhm  [0603R]
R?#17  10 kOhm  [0603R]
R?#18  330 Ohm  [0603R]
R?#19  100 Ohm  [0603R]
R?#20  100 Ohm  [0603R]
R?#21  2 kOhm  [0603R]
VT?#1  YJG40G10A  [PDFN5060-8L]
VT?#2  YJG40G10A  [PDFN5060-8L]
XP?#5  XH-2A  [XH-2.54-2]

### Ports
Pack+ (out, see measure_dev[1D]), Pack-(GND) (out, see measure_dev[1D]), VBus (in, see measure_dev[1D], ISO_DC_DC[1D], USB[4A])

### Nets
Pack+: DD?#8.5(BAT) R?#18.2 XP?#5.1 ; port Pack+
Pack-(GND): DD?#8.3(Vss) DD?#8.9(PGND) R?#17.2 R?#21.2 VT?#2.1(S) VT?#2.2(S) VT?#2.3(S) ; port Pack-(GND)
VBus: DD?#8.4(Vin) R?#15.2 R?#16.2 ; port VBus
NetC?#33_1: C?#33.1 DD?#9.5(BAT) R?#18.1
NetC?#33_2: C?#33.2 DD?#9.4(Vss) VT?#1.1(S) VT?#1.2(S) VT?#1.3(S) XP?#5.2
NetDD?#8_2: DD?#8.2(Iset) R?#17.1
NetDD?#8_7: DD?#8.7(STAT1) HL?.2(K)
NetDD?#8_8: DD?#8.8(EN) R?#16.1
NetDD?#9_2: DD?#9.2(Cout) R?#20.1
NetDD?#9_3: DD?#9.3(Dout) R?#19.1
NetDD?#9_6: DD?#9.6(V-) R?#21.1
NetHL?_1: HL?.1(A) R?#15.1
NetR?#19_2: R?#19.2 VT?#1.4(G)
NetR?#20_2: R?#20.2 VT?#2.4(G)
NetVT?#1_5: VT?#1.5(D) VT?#1.6(D) VT?#1.7(D) VT?#1.8(D) VT?#2.5(D) VT?#2.6(D) VT?#2.7(D) VT?#2.8(D)

Not connected (* = marked no-connect by the designer): DD?#8 1(NC)* 6(STAT2)*; DD?#9 1(NC)*

### Notes on the sheet
- I = 1000/Rset резистор на землю
- 2.2 к по даташиту
- Labels drawn without touching a wire or pin: Pack-(GND)
- (in symbol BQ29700) Dev
- (in symbol TP4056) Dev
- (in symbol XH-2A) Net

### Library data of the parts
C?#33 = CL10B104KB8NNN: as C?#3 on sheet CURRENT_MEASURE; Part Number: CL10B104KB8NNN; Package: 0603; Value: 100 nF
DD?#8 = TP4056: -; Manufacturer: UMW; Part Number: TP4056; Package: SO-8_PowerPAD; Type: Cell charger; Datasheet: https://static.chipdip.ru/lib/848/DOC018848830.pdf
DD?#9 = BQ29700: -; Manufacturer: TI; Part Number: BQ29700; Package: WSON-6P-1.5X1.5; Type: Cell protection ic; Datasheet: https://static.chipdip.ru/lib/213/DOC041213587.pdf
HL? = FYLS-0805BURC: Manufacturer: FORYARD; max Current: 30 mA; Color: RED; Type: SMD LED 0805 1 color; Part Number: FYLS-0805BURC; Package: 0805; Datasheet: https://www.elitan.ru/pdf/1/4/8/3/0/14830585.pdf
R?#15 R?#21 = RC0603FR-072KL: Manufacturer: Yageo; Tolerance: 1%; Power: 0.100 Watt; Part Number: RC0603FR-072KL; Package: 0603; Value: 2 kOhm
R?#16 = RC0603FR-071KL: as R?#5 on sheet MCU; Part Number: RC0603FR-071KL; Package: 0603; Value: 1 kOhm
R?#17 = RC0603FR-0710KL: as R?#9 on sheet MCU; Part Number: RC0603FR-0710KL; Package: 0603; Value: 10 kOhm
R?#18 = RC0603FR-07330RL: Manufacturer: Yageo; Tolerance: 1%; Power: 0.100 Watt; Part Number: RC0603FR-07330RL; Package: 0603; Value: 330 Ohm
R?#19 R?#20 = RC0603FR-07100RL: as R?#10 on sheet MCU; Part Number: RC0603FR-07100RL; Package: 0603; Value: 100 Ohm
VT?#1 VT?#2 = YJG40G10A: Manufacturer: Yangzhou Yangjie Electronic Technology; Type: N-chanel; max Ice/max Ids: 40 A; Max Ugs: +-20 V; Max Uds: 100 V; Max Rds: 21.5 mOhm; Part Number: YJG40G10A; Package: PDFN5060-8L; Min Ube: -; Max Uce: -; Min h21: -; Datasheet: https://static.chipdip.ru/lib/558/DOC045558825.pdf
XP?#5 = XH-2A: Manufacturer: JST; Imax: 3 A; Umax: 250 V; Mating Connector: XH-2Y; pin1: Bat+; pin2: Bat-; pin3: ???; Part Number: XH-2A; Datasheet: www.digikey.es/en/resources/datasheets/jst/xh-connector?srsltid=AfmBOoo9sSFbM4Eu62APurDC7SwqQmd8KbPfwRIn_mEfewP-rqs9ANFl; pin4: ???; pin5: ???; pin6: ???; pin7: ???; pin8: ???; pin9: ???; pin10: ???; pin11: ???; pin12: ???; pin13: ???; pin14: ???; pin15: ???; pin16: ???; pin17: ???; pin18: ???; pin19: ???; pin20: ???; pin21: ???; pin22: ???; pin23: ???; pin24: ???; pin25: ???; pin26: ???; pin27: ???; pin28: ???; pin29: ???; pin30: ???; pin31: ???; pin32: ???; pin33: ???; pin34: ???; pin35: ???; pin36: ???; pin37: ???; pin38: ???; pin39: ???; pin40: ???; pin41: ???; pin42: ???; pin43: ???; pin44: ???; pin45: ???; pin46: ???; pin47: ???; pin48: ???; pin49: ???; pin50: ???

## Sheet BUST_DC_DC.SchDoc
size A2; SheetNumber: 6; SheetTotal: 9
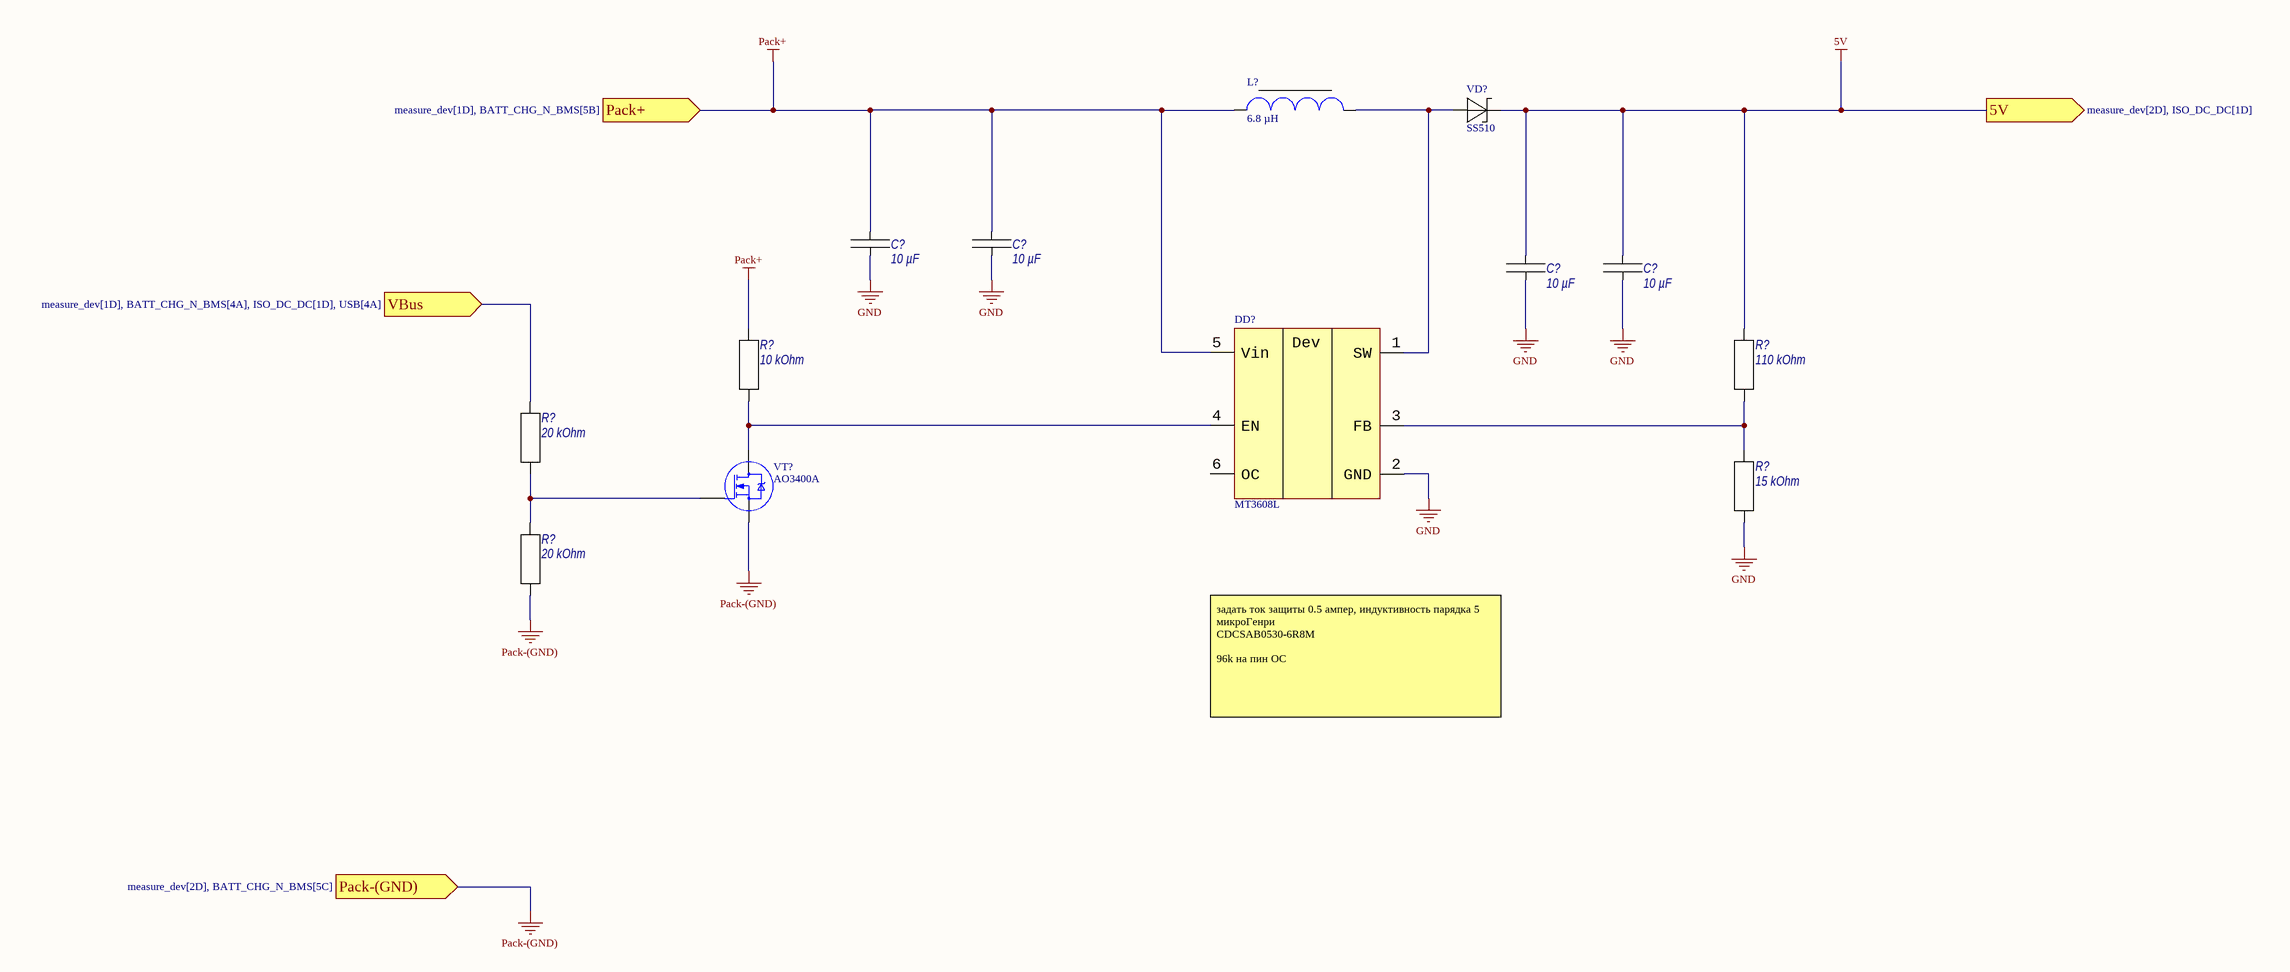
[diagram p6: BUST_DC_DC.SchDoc]

### Parts
(Parts that share a designator on the sheet are numbered #1, #2 ... from top to bottom, then left to right.)
C?#34  10 µF  [1206C]
C?#35  10 µF  [1206C]
C?#36  10 µF  [1206C]
C?#37  10 µF  [1206C]
DD?#10  MT3608L  [SOT-23-6]
L?#2  6.8 µH  [INDUCTOR_5.2_5.2_2.8]
R?#22  10 kOhm  [0603R]
R?#23  110 kOhm  [0603R]
R?#24  20 kOhm  [0603R]
R?#25  15 kOhm  [0603R]
R?#26  20 kOhm  [0603R]
VD?#8  SS510  [DO-214AC]
VT?#3  AO3400A  [SOT-23-3]

### Ports
5V (out, see measure_dev[2D], ISO_DC_DC[1D]), Pack+ (in, see measure_dev[1D], BATT_CHG_N_BMS[5B]), Pack-(GND) (in, see measure_dev[2D], BATT_CHG_N_BMS[5C]), VBus (in, see measure_dev[1D], BATT_CHG_N_BMS[4A], ISO_DC_DC[1D], USB[4A])

### Nets
5V: C?#36.1 C?#37.1 R?#23.1 VD?#8.C ; port 5V
GND: C?#34.2 C?#35.2 C?#36.2 C?#37.2 DD?#10.2(GND) R?#25.2
Pack+: C?#34.1 C?#35.1 DD?#10.5(Vin) L?#2.1 R?#22.1 ; port Pack+
Pack-(GND): R?#26.2 VT?#3.2(S) ; port Pack-(GND)
VBus: R?#24.1 ; port VBus
NetDD?#10_1: DD?#10.1(SW) L?#2.2 VD?#8.A
NetDD?#10_3: DD?#10.3(FB) R?#23.2 R?#25.1
NetDD?#10_4: DD?#10.4(EN) R?#22.2 VT?#3.3(D)
NetR?#24_2: R?#24.2 R?#26.1 VT?#3.1(G)

Not connected (* = marked no-connect by the designer): DD?#10 6(OC)

### Notes on the sheet
- задать ток защиты 0.5 ампер, индуктивность парядка 5 микроГенри
  CDCSAB0530-6R8M
  96k на пин OC
- (in symbol MT3608L) Dev

### Library data of the parts
C?#34-C?#37 = CL31B106KBHNNN: as C?#21 on sheet ISO_DC_DC; Part Number: CL31B106KBHNNN; Package: 1206; Value: 10 µF
DD?#10 = MT3608L: Manufacturer: Aerosemi; max Current: 2.5 A; Vin min: 2.2 V; Vin max: 16 V; Vout max: 20 V; Vref: 0.6 V; Part Number: MT3608L; Package: SOT-23-6; Vout min: -; Type: bust; Datasheet: https://static.chipdip.ru/lib/629/DOC041629802.pdf
L?#2 = CDCSAB0530-6R8M: Manufacturer: SCE; max Current: 4 A; Part Number: CDCSAB0530-6R8M; Package: 5.2*5.2*2.8; Inductance: 6.8 µH; Datasheet: https://static.chipdip.ru/lib/768/DOC047768810.pdf
R?#22 = RC0603FR-0710KL: as R?#9 on sheet MCU; Part Number: RC0603FR-0710KL; Package: 0603; Value: 10 kOhm
R?#23 = RC0603FR-07110KL: Manufacturer: Yageo; Tolerance: 1%; Power: 0.100 Watt; Part Number: RC0603FR-07110KL; Package: 0603; Value: 110 kOhm
R?#24 R?#26 = RC0603FR-0720KL: Manufacturer: Yageo; Tolerance: 1%; Power: 0.100 Watt; Part Number: RC0603FR-0720KL; Package: 0603; Value: 20 kOhm
R?#25 = RC0603FR-0715KL: Manufacturer: Yageo; Tolerance: 1%; Power: 0.100 Watt; Part Number: RC0603FR-0715KL; Package: 0603; Value: 15 kOhm
VD?#8 = SS510: as VD?#6 on sheet ISO_DC_DC; Part Number: SS510; Package: DO-214AC; Pppm: -; Datasheet: https://static.chipdip.ru/lib/293/DOC021293920.pdf
VT?#3 = AO3400A: Manufacturer: UMW; Type: N-chanel; max Ice/max Ids: 5.8 A; Max Ugs: +-12 V; Max Uds: 30 V; Max Rds: 52 mOhm; Part Number: AO3400A; Package: SOT-23-3; Min Ube: -; Max Uce: -; Min h21: -; Datasheet: https://static.chipdip.ru/lib/975/DOC014975392.pdf

## Sheet VOLTAGE_MEASURE.SchDoc
size A2; SheetNumber: 8; SheetTotal: 9
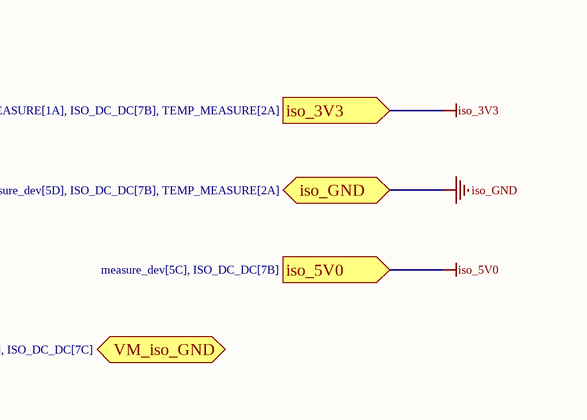
[diagram p7: VOLTAGE_MEASURE.SchDoc, top left]
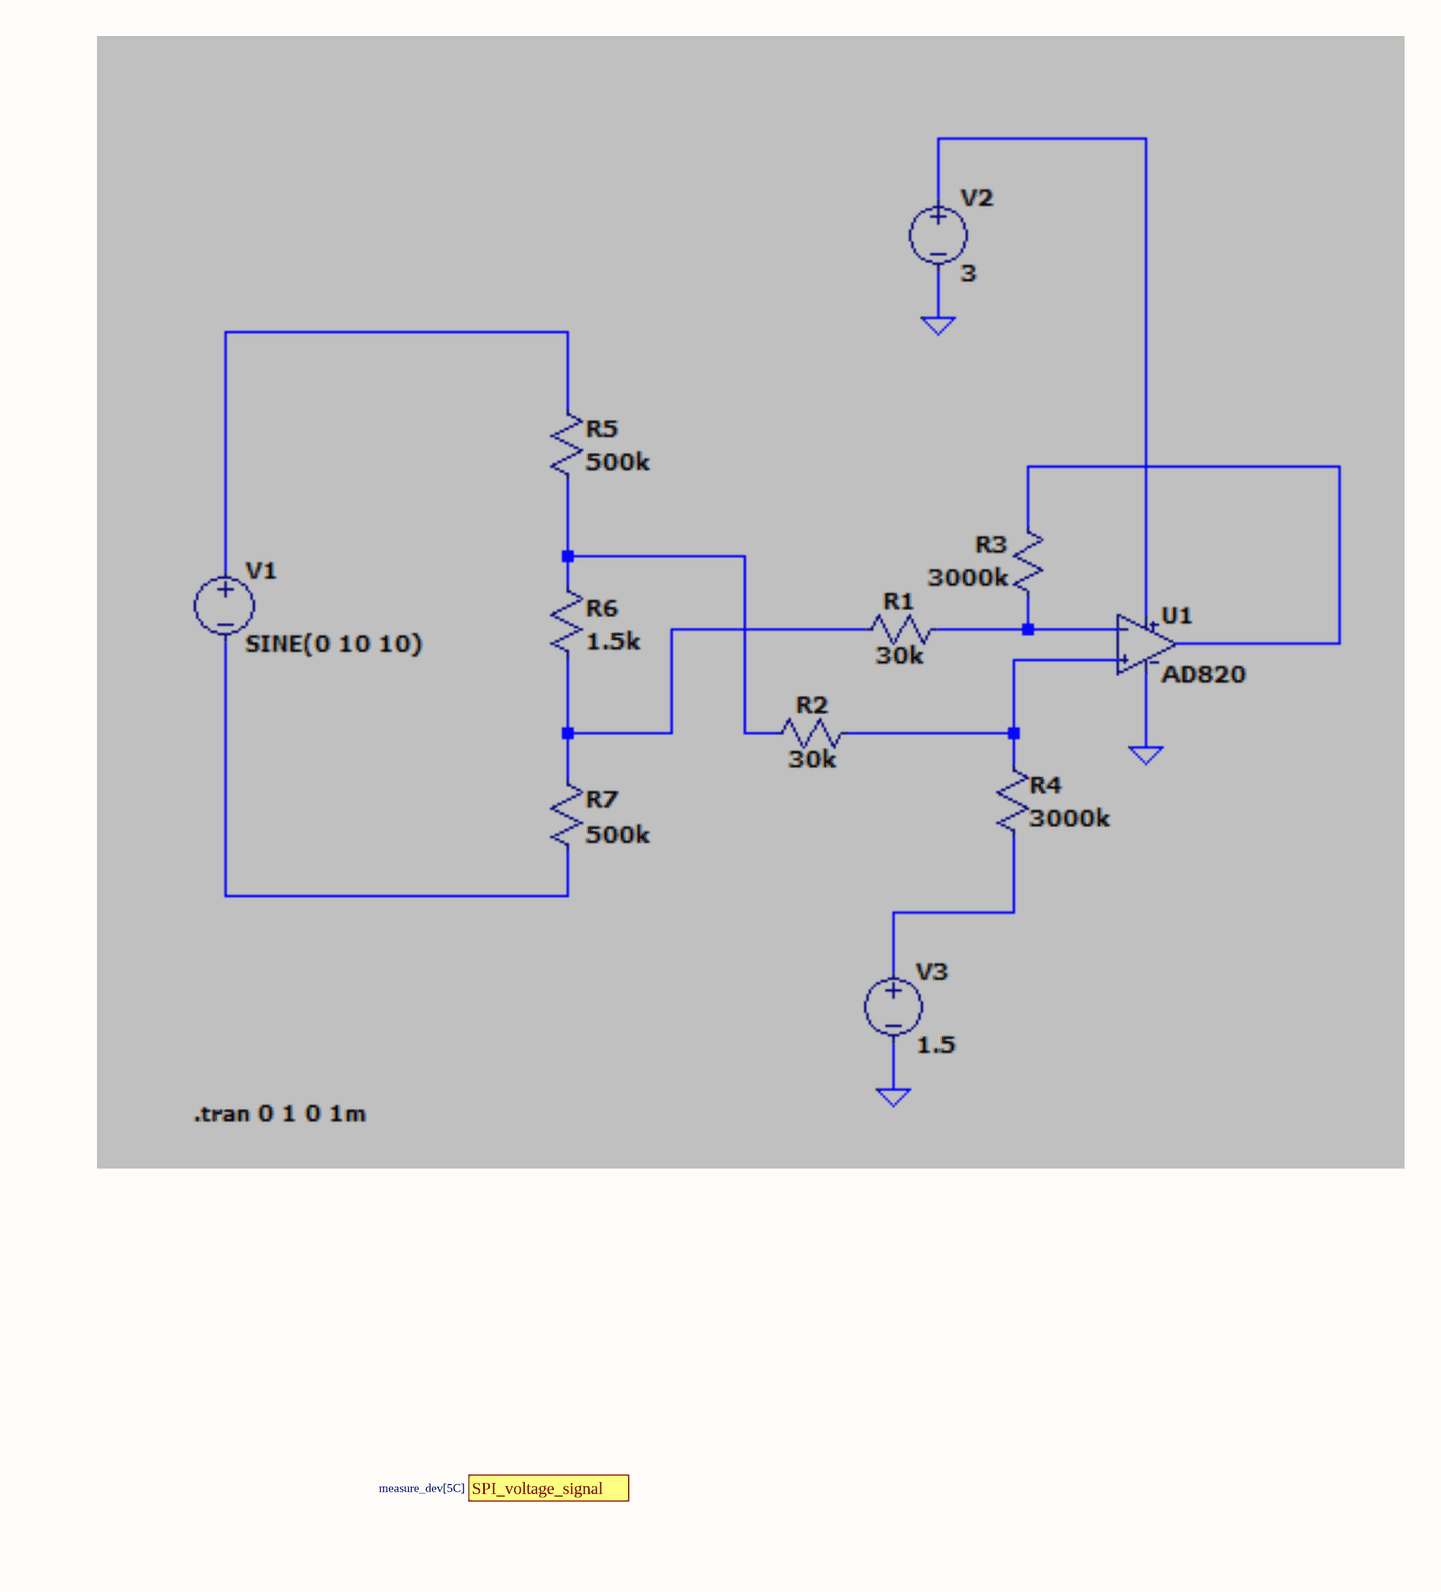
[diagram p8: VOLTAGE_MEASURE.SchDoc, top right]
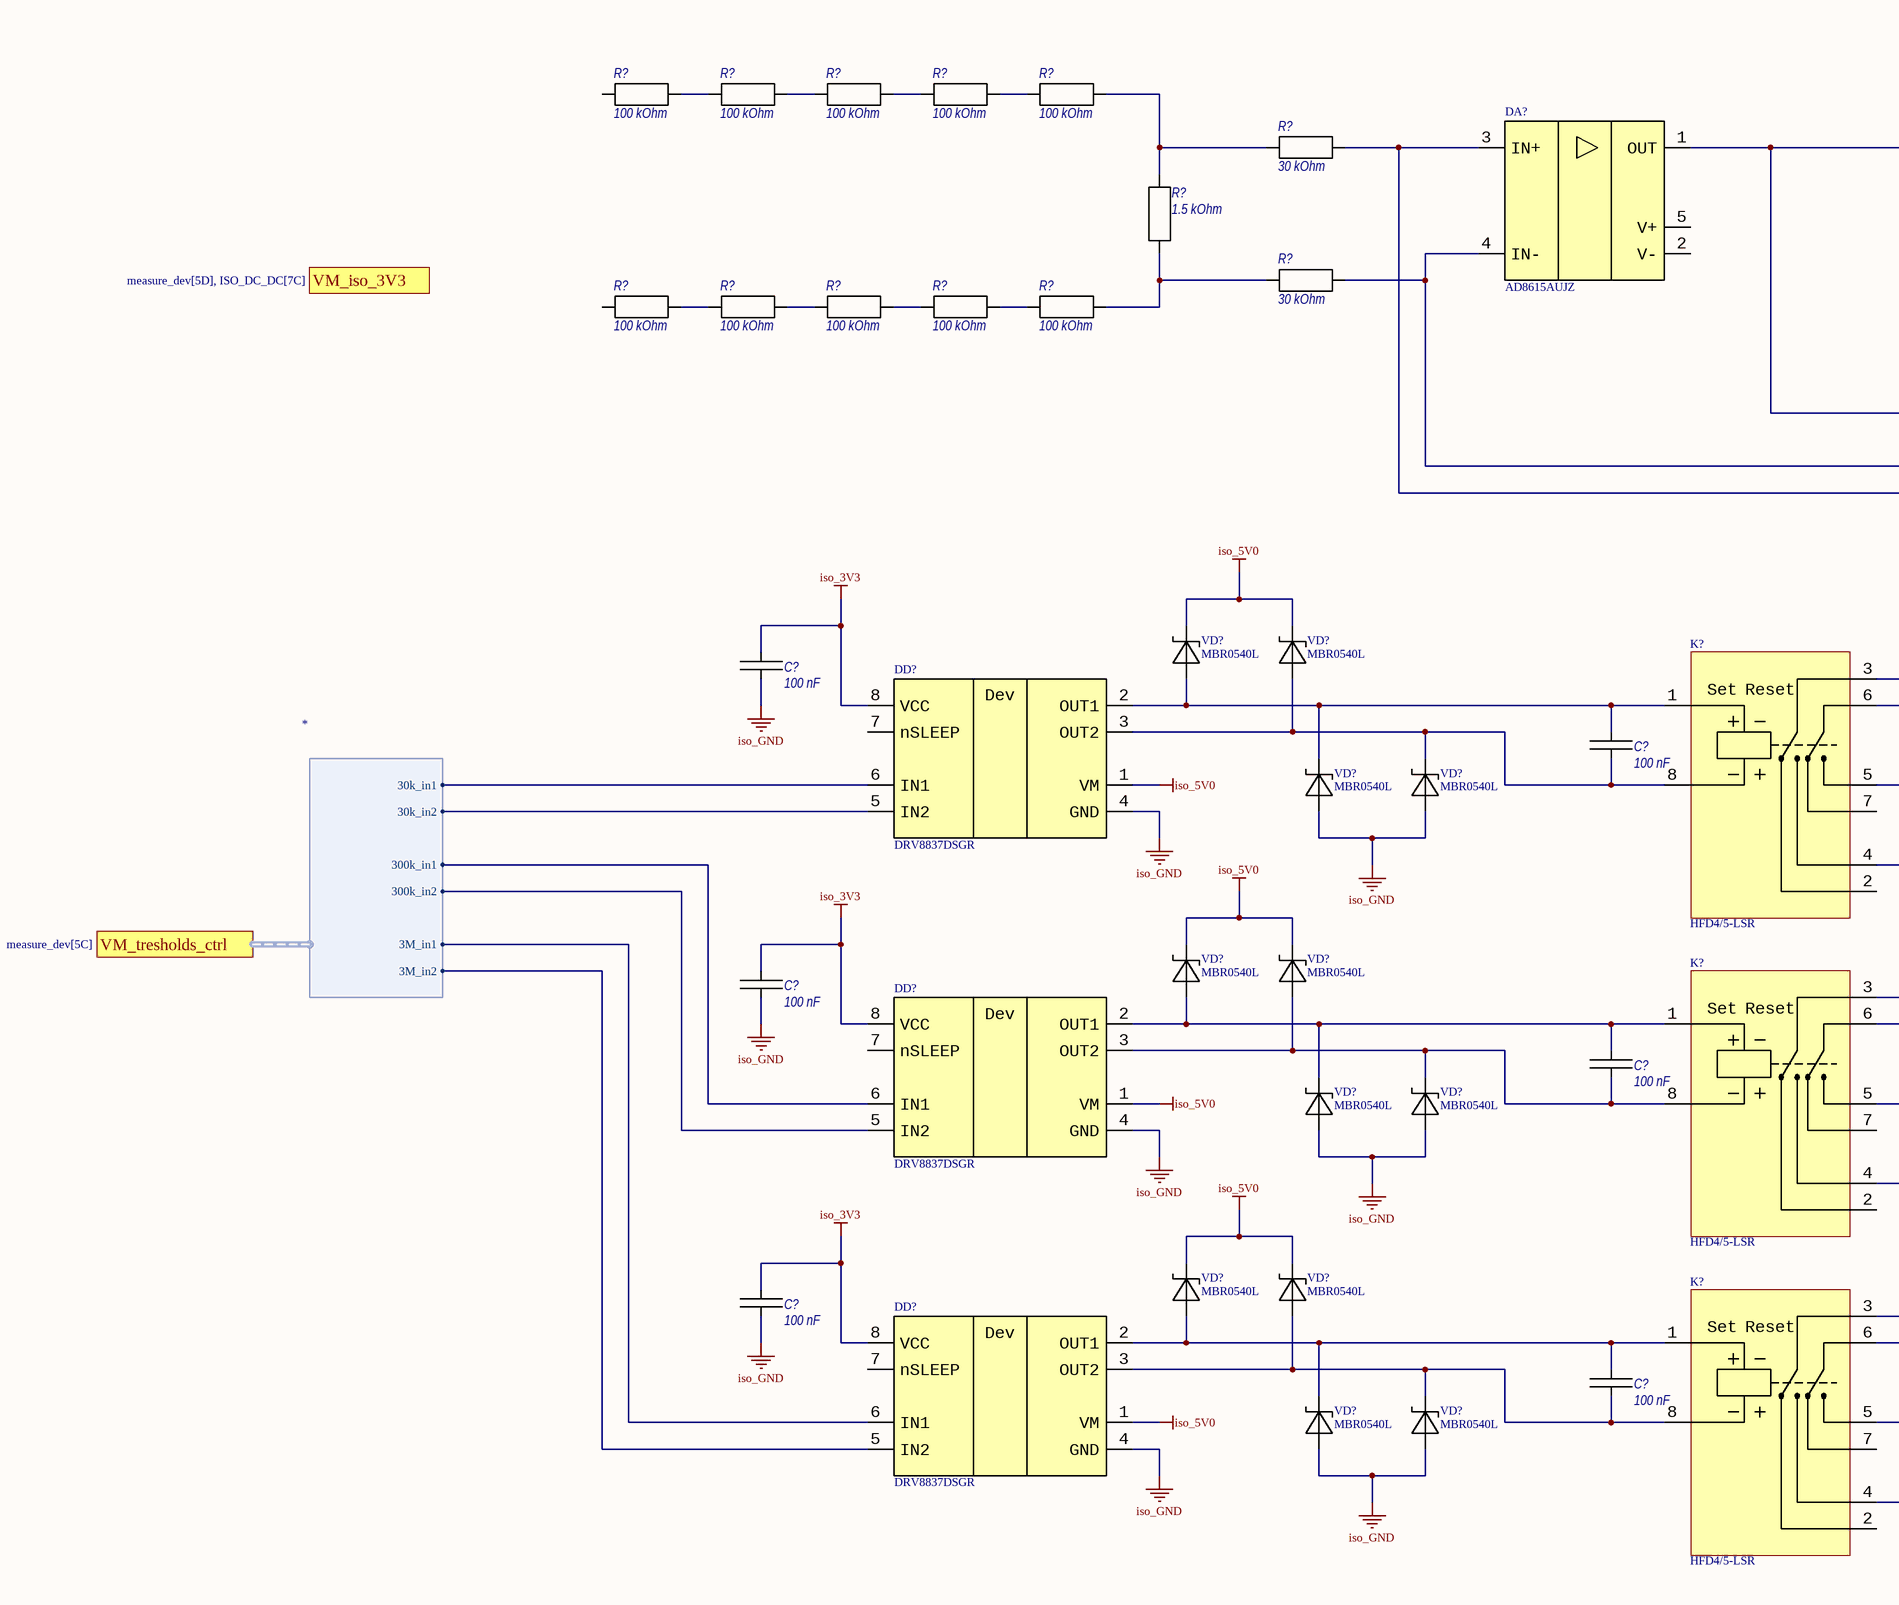
[diagram p9: VOLTAGE_MEASURE.SchDoc, bottom left]
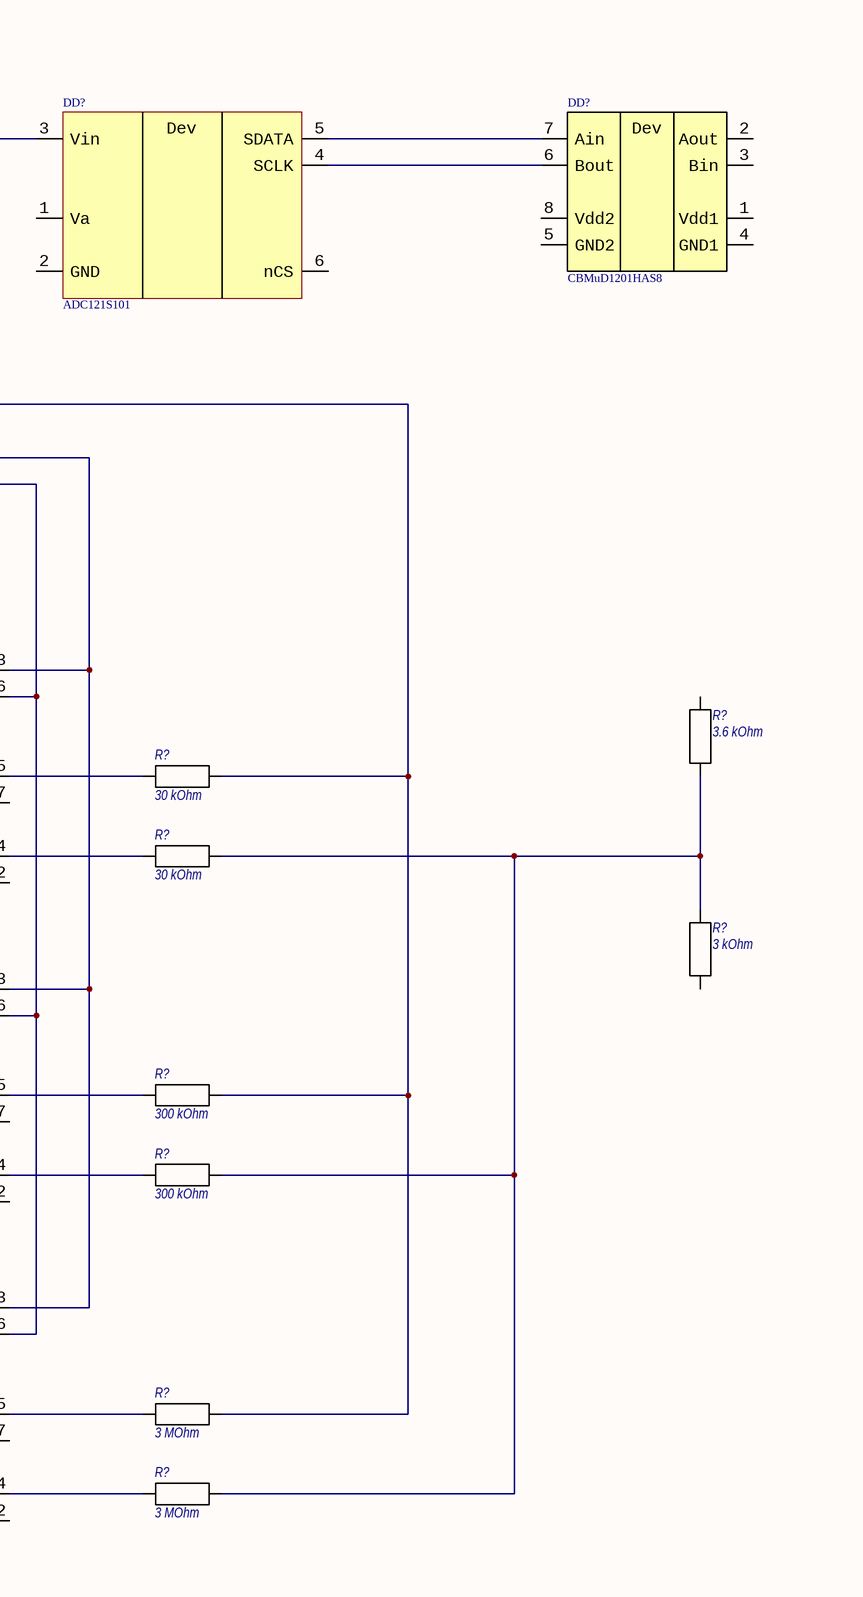
[diagram p10: VOLTAGE_MEASURE.SchDoc, bottom right]

### Parts
(Parts that share a designator on the sheet are numbered #1, #2 ... from top to bottom, then left to right.)
C?#38  100 nF  [0603C]
C?#39  100 nF  [0603C]
C?#40  100 nF  [0603C]
C?#41  100 nF  [0603C]
C?#42  100 nF  [0603C]
C?#43  100 nF  [0603C]
DA?  AD8615AUJZ  [SOT-23-5]
DD?#11  ADC121S101  [SOT-23-6]
DD?#12  CBMuD1201HAS8  [SO-8]
DD?#13  DRV8837DSGR  [WSON-8P-2X2]
DD?#14  DRV8837DSGR  [WSON-8P-2X2]
DD?#15  DRV8837DSGR  [WSON-8P-2X2]
K?#1  HFD4/5-LSR  [Relay_10_6.2_5.4]
K?#2  HFD4/5-LSR  [Relay_10_6.2_5.4]
K?#3  HFD4/5-LSR  [Relay_10_6.2_5.4]
R?#27  100 kOhm  [0805R]
R?#28  100 kOhm  [0805R]
R?#29  100 kOhm  [0805R]
R?#30  100 kOhm  [0805R]
R?#31  100 kOhm  [0805R]
R?#32  30 kOhm  [0603R]
R?#33  1.5 kOhm  [0603R]
R?#34  30 kOhm  [0603R]
R?#35  100 kOhm  [0805R]
R?#36  100 kOhm  [0805R]
R?#37  100 kOhm  [0805R]
R?#38  100 kOhm  [0805R]
R?#39  100 kOhm  [0805R]
R?#40  3.6 kOhm  [0603R]
R?#41  30 kOhm  [0603R]
R?#42  30 kOhm  [0603R]
R?#43  3 kOhm  [0603R]
R?#44  300 kOhm  [0603R]
R?#45  300 kOhm  [0603R]
R?#46  3 MOhm  [0603R]
R?#47  3 MOhm  [0603R]
VD?#9  MBR0540L  [SOD-123]
VD?#10  MBR0540L  [SOD-123]
VD?#11  MBR0540L  [SOD-123]
VD?#12  MBR0540L  [SOD-123]
VD?#13  MBR0540L  [SOD-123]
VD?#14  MBR0540L  [SOD-123]
VD?#15  MBR0540L  [SOD-123]
VD?#16  MBR0540L  [SOD-123]
VD?#17  MBR0540L  [SOD-123]
VD?#18  MBR0540L  [SOD-123]
VD?#19  MBR0540L  [SOD-123]
VD?#20  MBR0540L  [SOD-123]

### Ports
iso_3V3 (in, see measure_dev[5D], CURRENT_MEASURE[1A], ISO_DC_DC[7B], TEMP_MEASURE[2A]), iso_5V0 (in, see measure_dev[5C], ISO_DC_DC[7B]), iso_GND (bidir, see measure_dev[5D], ISO_DC_DC[7B], TEMP_MEASURE[2A]), SPI_voltage_signal (see measure_dev[5C]), VM_iso_3V3 (in, see measure_dev[5D], ISO_DC_DC[7C]), VM_iso_GND (bidir, see measure_dev[5D], ISO_DC_DC[7C]), VM_tresholds_ctrl (harness *, see measure_dev[5C])

### Harnesses
*: 30k_in1, 30k_in2, 300k_in1, 300k_in2, 3M_in1, 3M_in2

### Nets
iso_3V3: C?#38.1 C?#40.1 C?#42.1 DD?#13.8(VCC) DD?#14.8(VCC) DD?#15.8(VCC) ; port iso_3V3
iso_5V0: DD?#13.1(VM) DD?#14.1(VM) DD?#15.1(VM) VD?#9.C VD?#10.C VD?#13.C VD?#14.C VD?#17.C VD?#18.C ; port iso_5V0
iso_GND: C?#38.2 C?#40.2 C?#42.2 DD?#13.4(GND) DD?#14.4(GND) DD?#15.4(GND) VD?#11.A VD?#12.A VD?#15.A VD?#16.A VD?#19.A VD?#20.A ; port iso_GND
NetC?#39_1: C?#39.1 DD?#13.2(OUT1) K?#1.1 VD?#9.A VD?#11.C
NetC?#39_2: C?#39.2 DD?#13.3(OUT2) K?#1.8 VD?#10.A VD?#12.C
NetC?#41_1: C?#41.1 DD?#14.2(OUT1) K?#2.1 VD?#13.A VD?#15.C
NetC?#41_2: C?#41.2 DD?#14.3(OUT2) K?#2.8 VD?#14.A VD?#16.C
NetC?#43_1: C?#43.1 DD?#15.2(OUT1) K?#3.1 VD?#17.A VD?#19.C
NetC?#43_2: C?#43.2 DD?#15.3(OUT2) K?#3.8 VD?#18.A VD?#20.C
NetDA?_1: DA?.1(OUT) DD?#11.3(Vin) R?#41.1 R?#44.1 R?#46.1
NetDA?_3: DA?.3(IN+) K?#1.6 K?#2.6 K?#3.6 R?#32.1
NetDA?_4: DA?.4(IN-) K?#1.3 K?#2.3 K?#3.3 R?#34.1
NetDD?#11_4: DD?#11.4(SCLK) DD?#12.6(Bout)
NetDD?#11_5: DD?#11.5(SDATA) DD?#12.7(Ain)
NetDD?#13_5: DD?#13.5(IN2) ; port VM_tresholds_ctrl.30k_in2
NetDD?#13_6: DD?#13.6(IN1) ; port VM_tresholds_ctrl.30k_in1
NetDD?#14_5: DD?#14.5(IN2) ; port VM_tresholds_ctrl.300k_in2
NetDD?#14_6: DD?#14.6(IN1) ; port VM_tresholds_ctrl.300k_in1
NetDD?#15_5: DD?#15.5(IN2) ; port VM_tresholds_ctrl.3M_in2
NetDD?#15_6: DD?#15.6(IN1) ; port VM_tresholds_ctrl.3M_in1
NetK?#1_4: K?#1.4 R?#42.2
NetK?#1_5: K?#1.5 R?#41.2
NetK?#2_4: K?#2.4 R?#45.2
NetK?#2_5: K?#2.5 R?#44.2
NetK?#3_4: K?#3.4 R?#47.2
NetK?#3_5: K?#3.5 R?#46.2
NetR?#27_1: R?#27.1 R?#28.2
NetR?#28_1: R?#28.1 R?#29.2
NetR?#29_1: R?#29.1 R?#30.2
NetR?#30_1: R?#30.1 R?#31.2
NetR?#31_1: R?#31.1 R?#32.2 R?#33.1
NetR?#33_2: R?#33.2 R?#34.2 R?#39.1
NetR?#35_1: R?#35.1 R?#36.2
NetR?#36_1: R?#36.1 R?#37.2
NetR?#37_1: R?#37.1 R?#38.2
NetR?#38_1: R?#38.1 R?#39.2
NetR?#40_2: R?#40.2 R?#42.1 R?#43.1 R?#45.1 R?#47.1

Not connected (* = marked no-connect by the designer): DA? 2(V-) 5(V+); DD?#11 1(Va) 2(GND) 6(nCS); DD?#12 1(Vdd1) 2(Aout) 3(Bin) 4(GND1) 5(GND2) 8(Vdd2); DD?#13 7(nSLEEP); DD?#14 7(nSLEEP); DD?#15 7(nSLEEP); K?#1 2 7; K?#2 2 7; K?#3 2 7; R?#27 2; R?#35 2; R?#40 1; R?#43 2

### Notes on the sheet
- (in symbol ADC121S101) Dev
- (in symbol CBMuD1201HAS8) Dev
- (in symbol DRV8837DSGR) Dev
- (in symbol HFD4/5-LSR) Set; Reset

### Library data of the parts
C?#38-C?#43 = CL10B104KB8NNN: as C?#3 on sheet CURRENT_MEASURE; Part Number: CL10B104KB8NNN; Package: 0603; Value: 100 nF
DA? = AD8615AUJZ: Manufacturer: AD; Number of Channels: 1; Supply Voltage: 2.7 - 5 V; Supply Current: 2.5 mA; Iout: 150 mA; Ib: 0.2 - 1 pA; Ios: 0.1 — 0.5 pA; Uos: 0.1 mV; Fin: 20 Mhz; Part Number: AD8615AUJZ; Package: SOT-23-5; Type: rail-to-rail, low-power, precizion; Datasheet: https://www.elitan.ru/pdf/0//7//0//8//5//07085661.pdf
DD?#11 = ADC121S101: 1 chanel ADC, 12 bit, SPI, 1 MSPS; Manufacturer: TI; Part Number: ADC121S101; Package: SOT-23-6; Datasheet: https://www.elitan.ru/pdf/0//3//7//8//7//03787719.pdf
DD?#12 = CBMuD1201HAS8: as DD?#5 on sheet USB; Part Number: CBMuD1201HAS8; Package: SO-8; Input Current: -; Input Reverse Voltage: -; Output Current: -; Output Power: -; Type: digital isolator 2 directions 2 ways; Datasheet: https://static.chipdip.ru/lib/815/DOC059815915.pdf
DD?#13-DD?#15 = DRV8837DSGR: -; Manufacturer: TI; Part Number: DRV8837DSGR; Package: WSON-8P-2X2; Type: bridge; Datasheet: https://static.chipdip.ru/lib/788/DOC021788244.pdf
K?#1-K?#3 = HFD4/5-LSR: Manufacturer: Hongfa; Coil Voltage: 5 V; Coil Current/Resistance: 250 Ohm; Max Switching Voltage: 220VDC/250VAC; Max Switching Current: 2 A at 30 VDC, 0.5 A at 125 VAC; Part Number: HFD4/5-LSR; Package: Relay_10_6.2_5.4; Datasheet: https://static.chipdip.ru/lib/796/DOC059796560.pdf
R?#27-R?#31 R?#35-R?#39 = RC0805FR-07100KL: Manufacturer: Yageo; Tolerance: 1%; Power: 0.125 Watt; Part Number: RC0805FR-07100KL; Package: 0805; Value: 100 kOhm
R?#32 R?#34 R?#41 R?#42 = RC0603FR-0730KL: Manufacturer: Yageo; Tolerance: 1%; Power: 0.100 Watt; Part Number: RC0603FR-0730KL; Package: 0603; Value: 30 kOhm
R?#33 = RC0603FR-071K5L: Manufacturer: Yageo; Tolerance: 1%; Power: 0.100 Watt; Part Number: RC0603FR-071K5L; Package: 0603; Value: 1.5 kOhm
R?#40 = RC0603FR-073K6L: Manufacturer: Yageo; Tolerance: 1%; Power: 0.100 Watt; Part Number: RC0603FR-073K6L; Package: 0603; Value: 3.6 kOhm
R?#43 = RC0603FR-073KL: Manufacturer: Yageo; Tolerance: 1%; Power: 0.100 Watt; Part Number: RC0603FR-073KL; Package: 0603; Value: 3 kOhm
R?#44 R?#45 = RC0603FR-07300KL: Manufacturer: Yageo; Tolerance: 1%; Power: 0.100 Watt; Part Number: RC0603FR-07300KL; Package: 0603; Value: 300 kOhm
R?#46 R?#47 = RC0603FR-073ML: Manufacturer: Yageo; Tolerance: 1%; Power: 0.100 Watt; Part Number: RC0603FR-073ML; Package: 0603; Value: 3 MOhm
VD?#9-VD?#20 = MBR0540L: as VD?#2 on sheet MCU; Part Number: MBR0540L; Package: SOD-123; Pppm: -; Datasheet: https://doc.platan.ru/pdf/datasheets/hottech/MBR0520L-0540L.pdf

## Sheet TEMP_MEASURE.SchDoc
size A4; SheetNumber: 7; SheetTotal: 9
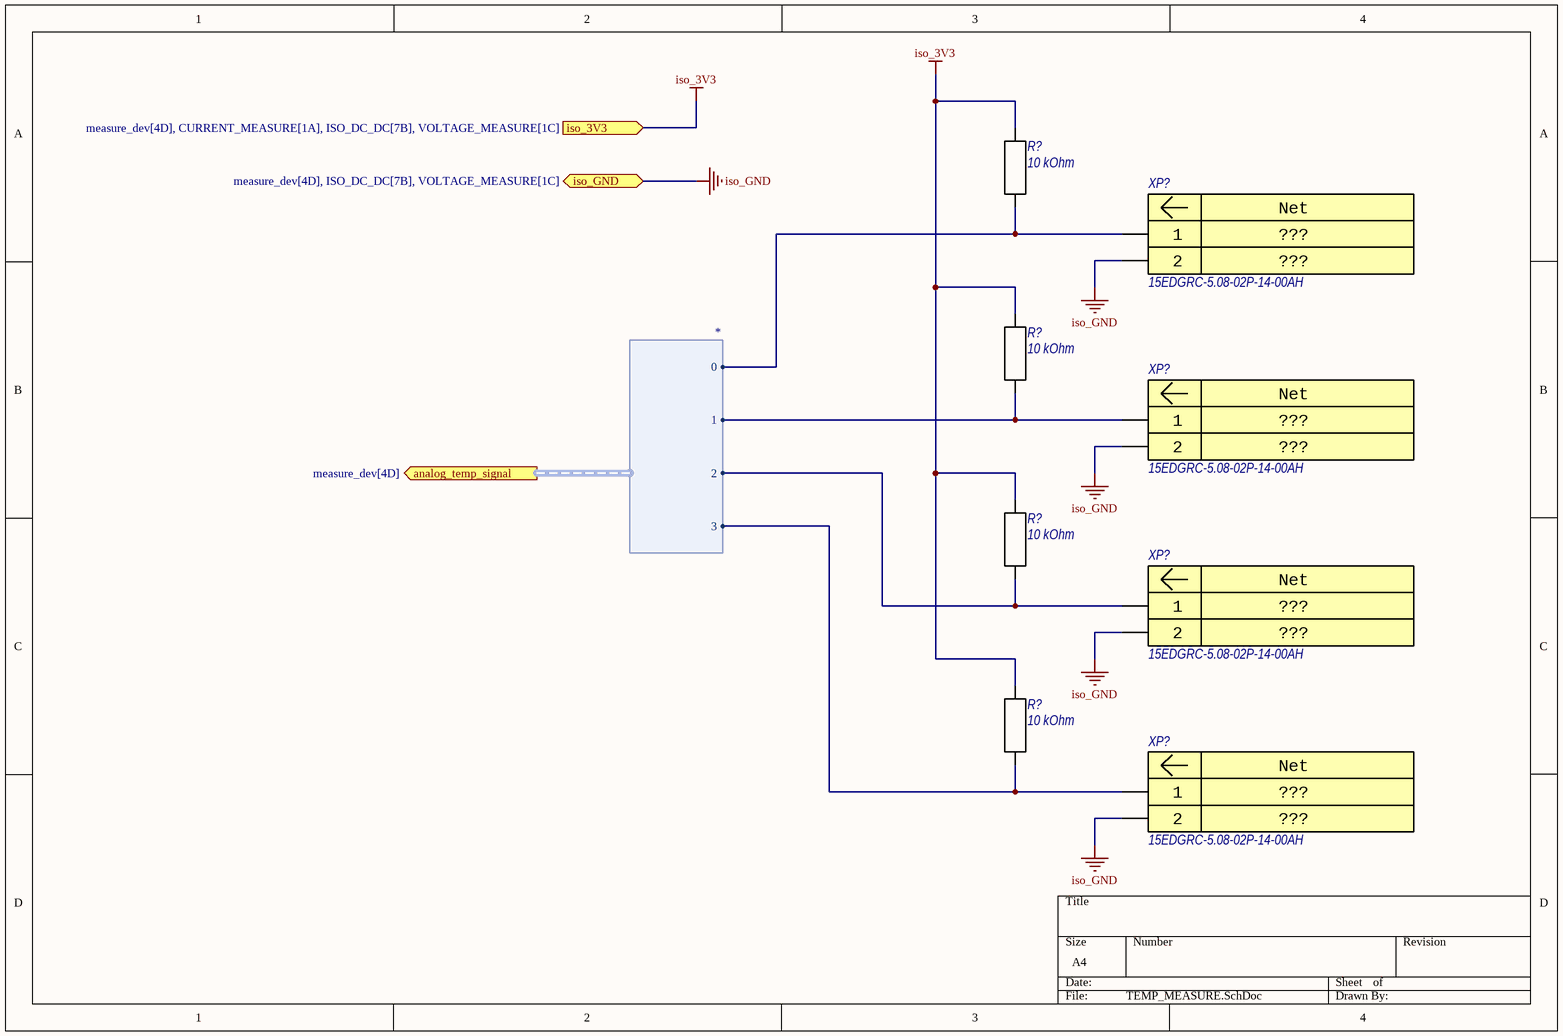
[diagram p11: TEMP_MEASURE.SchDoc]

### Parts
(Parts that share a designator on the sheet are numbered #1, #2 ... from top to bottom, then left to right.)
R?#48  10 kOhm  [0603R]
R?#49  10 kOhm  [0603R]
R?#50  10 kOhm  [0603R]
R?#51  10 kOhm  [0603R]
XP?#6  15EDGRC-5.08-02P-14-00AH  [15EDGRC-5.08-02P]
XP?#7  15EDGRC-5.08-02P-14-00AH  [15EDGRC-5.08-02P]
XP?#8  15EDGRC-5.08-02P-14-00AH  [15EDGRC-5.08-02P]
XP?#9  15EDGRC-5.08-02P-14-00AH  [15EDGRC-5.08-02P]

### Ports
analog_temp_signal (out, harness *, see measure_dev[4D]), iso_3V3 (in, see measure_dev[4D], CURRENT_MEASURE[1A], ISO_DC_DC[7B], VOLTAGE_MEASURE[1C]), iso_GND (bidir, see measure_dev[4D], ISO_DC_DC[7B], VOLTAGE_MEASURE[1C])

### Harnesses
*: 0, 1, 2, 3

### Nets
iso_3V3: R?#48.2 R?#49.2 R?#50.2 R?#51.2 ; port iso_3V3
iso_GND: XP?#6.2 XP?#7.2 XP?#8.2 XP?#9.2 ; port iso_GND
NetR?#48_1: R?#48.1 XP?#6.1 ; port analog_temp_signal.0
NetR?#49_1: R?#49.1 XP?#7.1 ; port analog_temp_signal.1
NetR?#50_1: R?#50.1 XP?#8.1 ; port analog_temp_signal.2
NetR?#51_1: R?#51.1 XP?#9.1 ; port analog_temp_signal.3

### Notes on the sheet
- (in symbol 15EDGRC-5.08-02P-14-00AH) Net

### Library data of the parts
R?#48-R?#51 = RC0603FR-0710KL: as R?#9 on sheet MCU; Part Number: RC0603FR-0710KL; Package: 0603; Value: 10 kOhm
XP?#6-XP?#9 = 15EDGRC-5.08-02P-14-00AH: as XP?#1 on sheet CURRENT_MEASURE; Part Number: 15EDGRC-5.08-02P-14-00AH; Datasheet: https://cdn.promelec.ru/upload/items/2020/05/15/15EDGRC-5.08.pdf; pin2: ???; pin3: ???; pin4: ???; pin5: ???; pin6: ???; pin7: ???; pin8: ???; pin9: ???; pin10: ???; pin11: ???; pin12: ???; pin13: ???; pin14: ???; pin15: ???; pin16: ???; pin17: ???; pin18: ???; pin19: ???; pin20: ???; pin21: ???; pin22: ???; pin23: ???; pin24: ???; pin25: ???; pin26: ???; pin27: ???; pin28: ???; pin29: ???; pin30: ???; pin31: ???; pin32: ???; pin33: ???; pin34: ???; pin35: ???; pin36: ???; pin37: ???; pin38: ???; pin39: ???; pin40: ???; pin41: ???; pin42: ???; pin43: ???; pin44: ???; pin45: ???; pin46: ???; pin47: ???; pin48: ???; pin49: ???; pin50: ???

## Nets that join several sheets
5V: ISO_DC_DC (VD?#7.A), BUST_DC_DC (C?#36.1 C?#37.1 R?#23.1 VD?#8.C)
GND: USB (13 pins), BUST_DC_DC (6 pins)
iso_3V3: CURRENT_MEASURE (C?#3.1 DD?#1.6 R?#3.1), MCU (13 pins), USB (C?#20.1 DD?#5.8), ISO_DC_DC (C?#26.1 DD?#6.2), VOLTAGE_MEASURE (6 pins), TEMP_MEASURE (R?#48.2 R?#49.2 R?#50.2 R?#51.2)
iso_5V0: ISO_DC_DC (5 pins), VOLTAGE_MEASURE (9 pins)
iso_GND: CURRENT_MEASURE (5 pins), MCU (24 pins), USB (C?#20.2 DD?#5.5), ISO_DC_DC (6 pins), VOLTAGE_MEASURE (12 pins), TEMP_MEASURE (XP?#6.2 XP?#7.2 XP?#8.2 XP?#9.2)
Pack+: BATT_CHG_N_BMS (DD?#8.5 R?#18.2 XP?#5.1), BUST_DC_DC (5 pins)
Pack-(GND): ISO_DC_DC (6 pins), BATT_CHG_N_BMS (7 pins), BUST_DC_DC (R?#26.2 VT?#3.2)
VBus: USB (8 pins), ISO_DC_DC (VD?#6.A), BATT_CHG_N_BMS (DD?#8.4 R?#15.2 R?#16.2), BUST_DC_DC (R?#24.1)